# EasyEDA Pro project RK3566_handy_V1.0.epro, schematic RK3566_2, sheets 14 to 20 of 25

## Sheets
14 RK3566_OSC/PLL/PMUO1/2: Create Date: 2026-09-20; Page Name: RK3566_OSC/PLL/PMUO1/2; Update Date: 2026-09-20
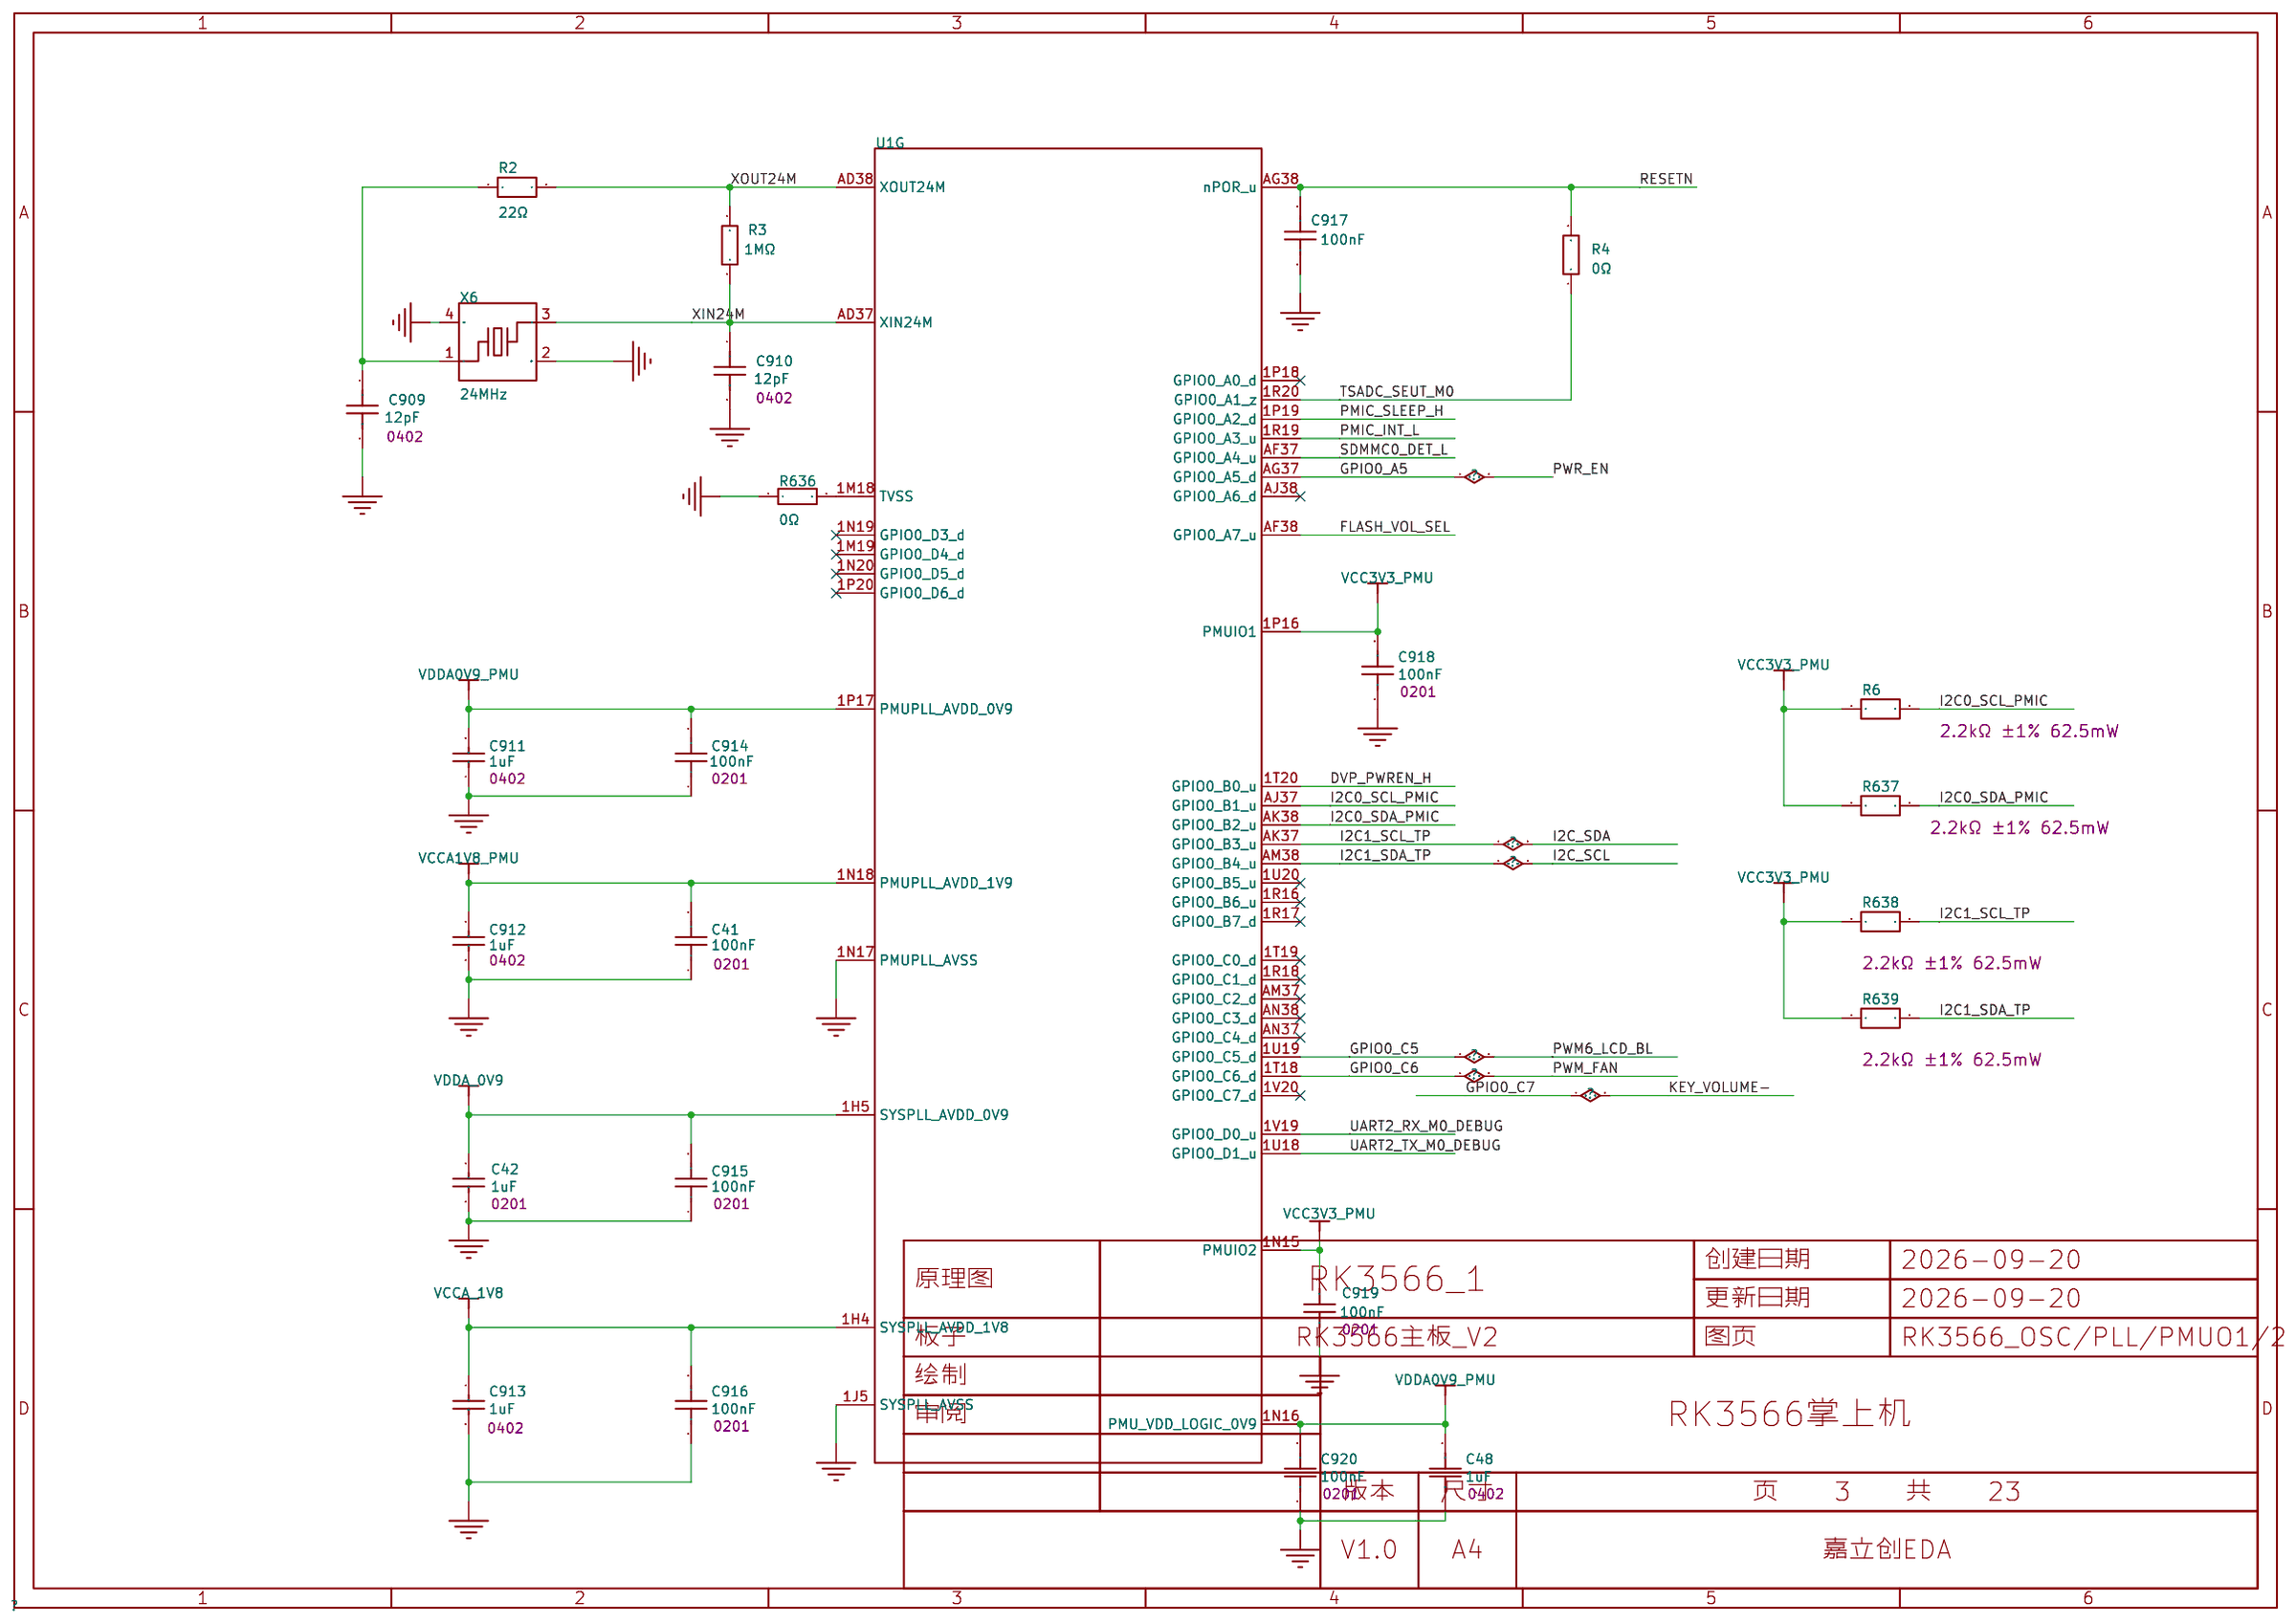
[diagram p13: RK3566_OSC/PLL/PMUO1/2]
15 RK3566_VO INTERFACE_2: Create Date: 2026-09-20; Page Name: RK3566_VO INTERFACE_2; Update Date: 2026-09-20
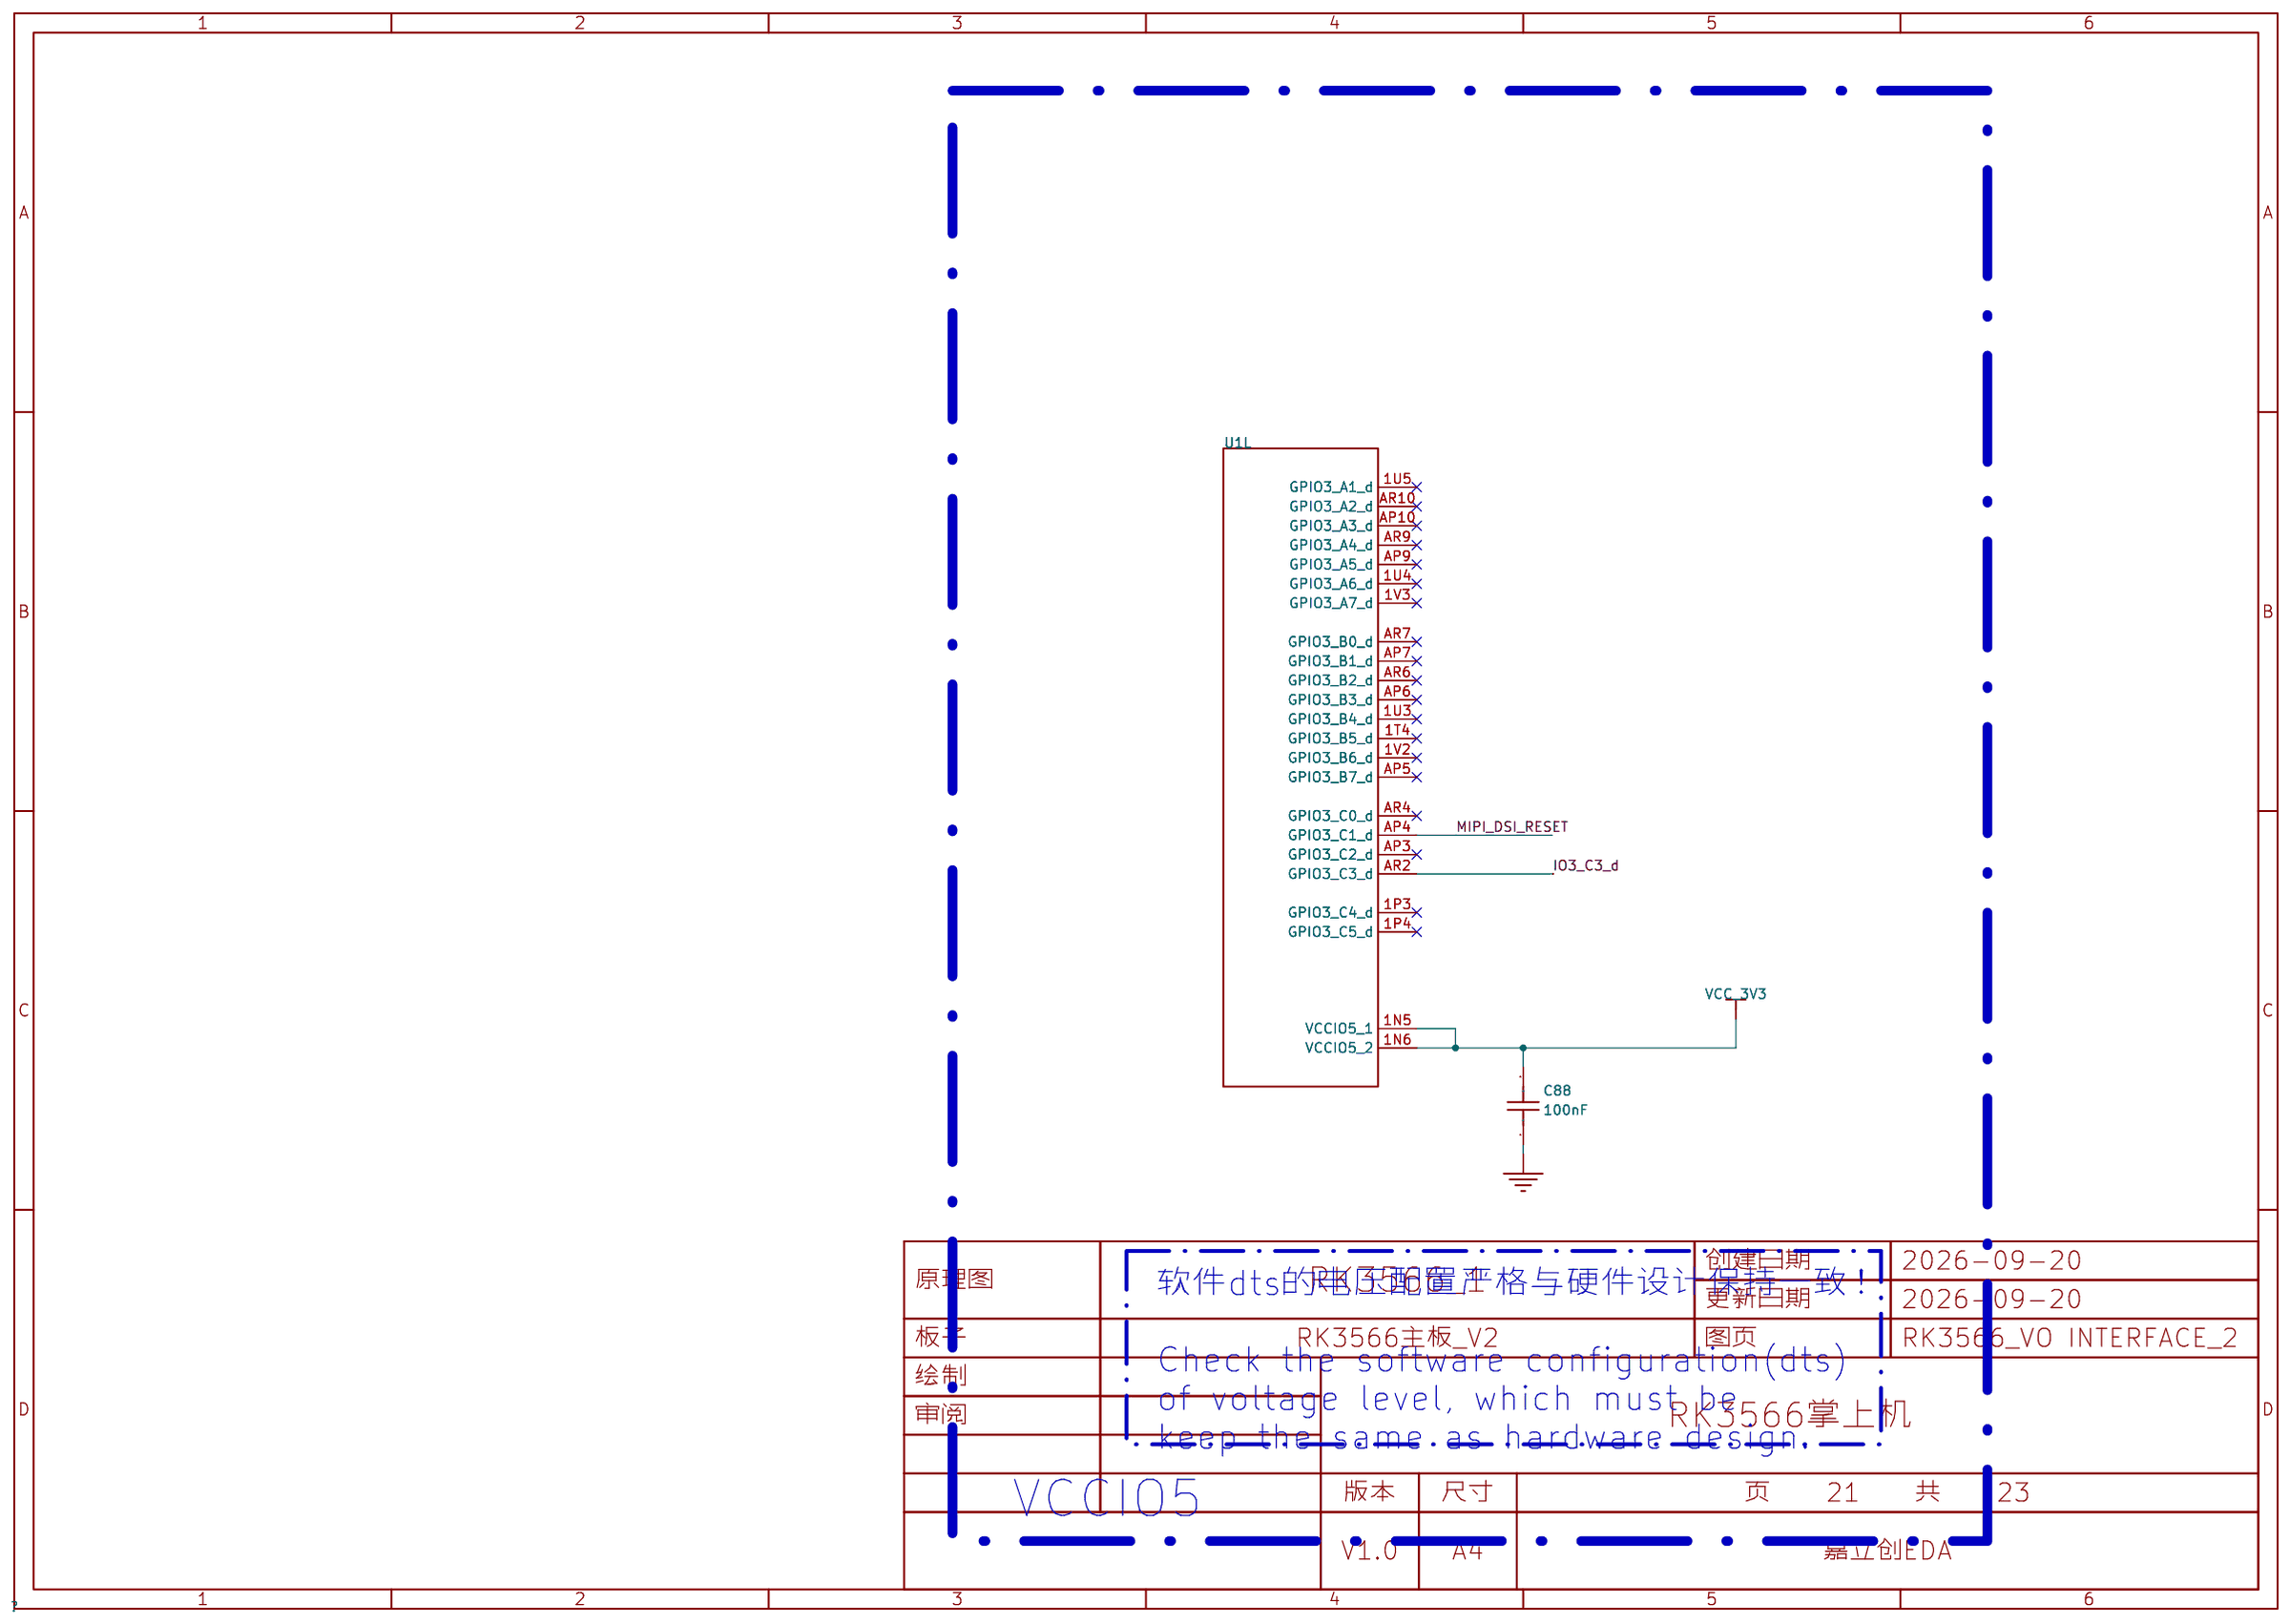
[diagram p14: RK3566_VO INTERFACE_2]
16 DEBUG: Create Date: 2026-09-22; Page Name: DEBUG; Update Date: 2026-09-22
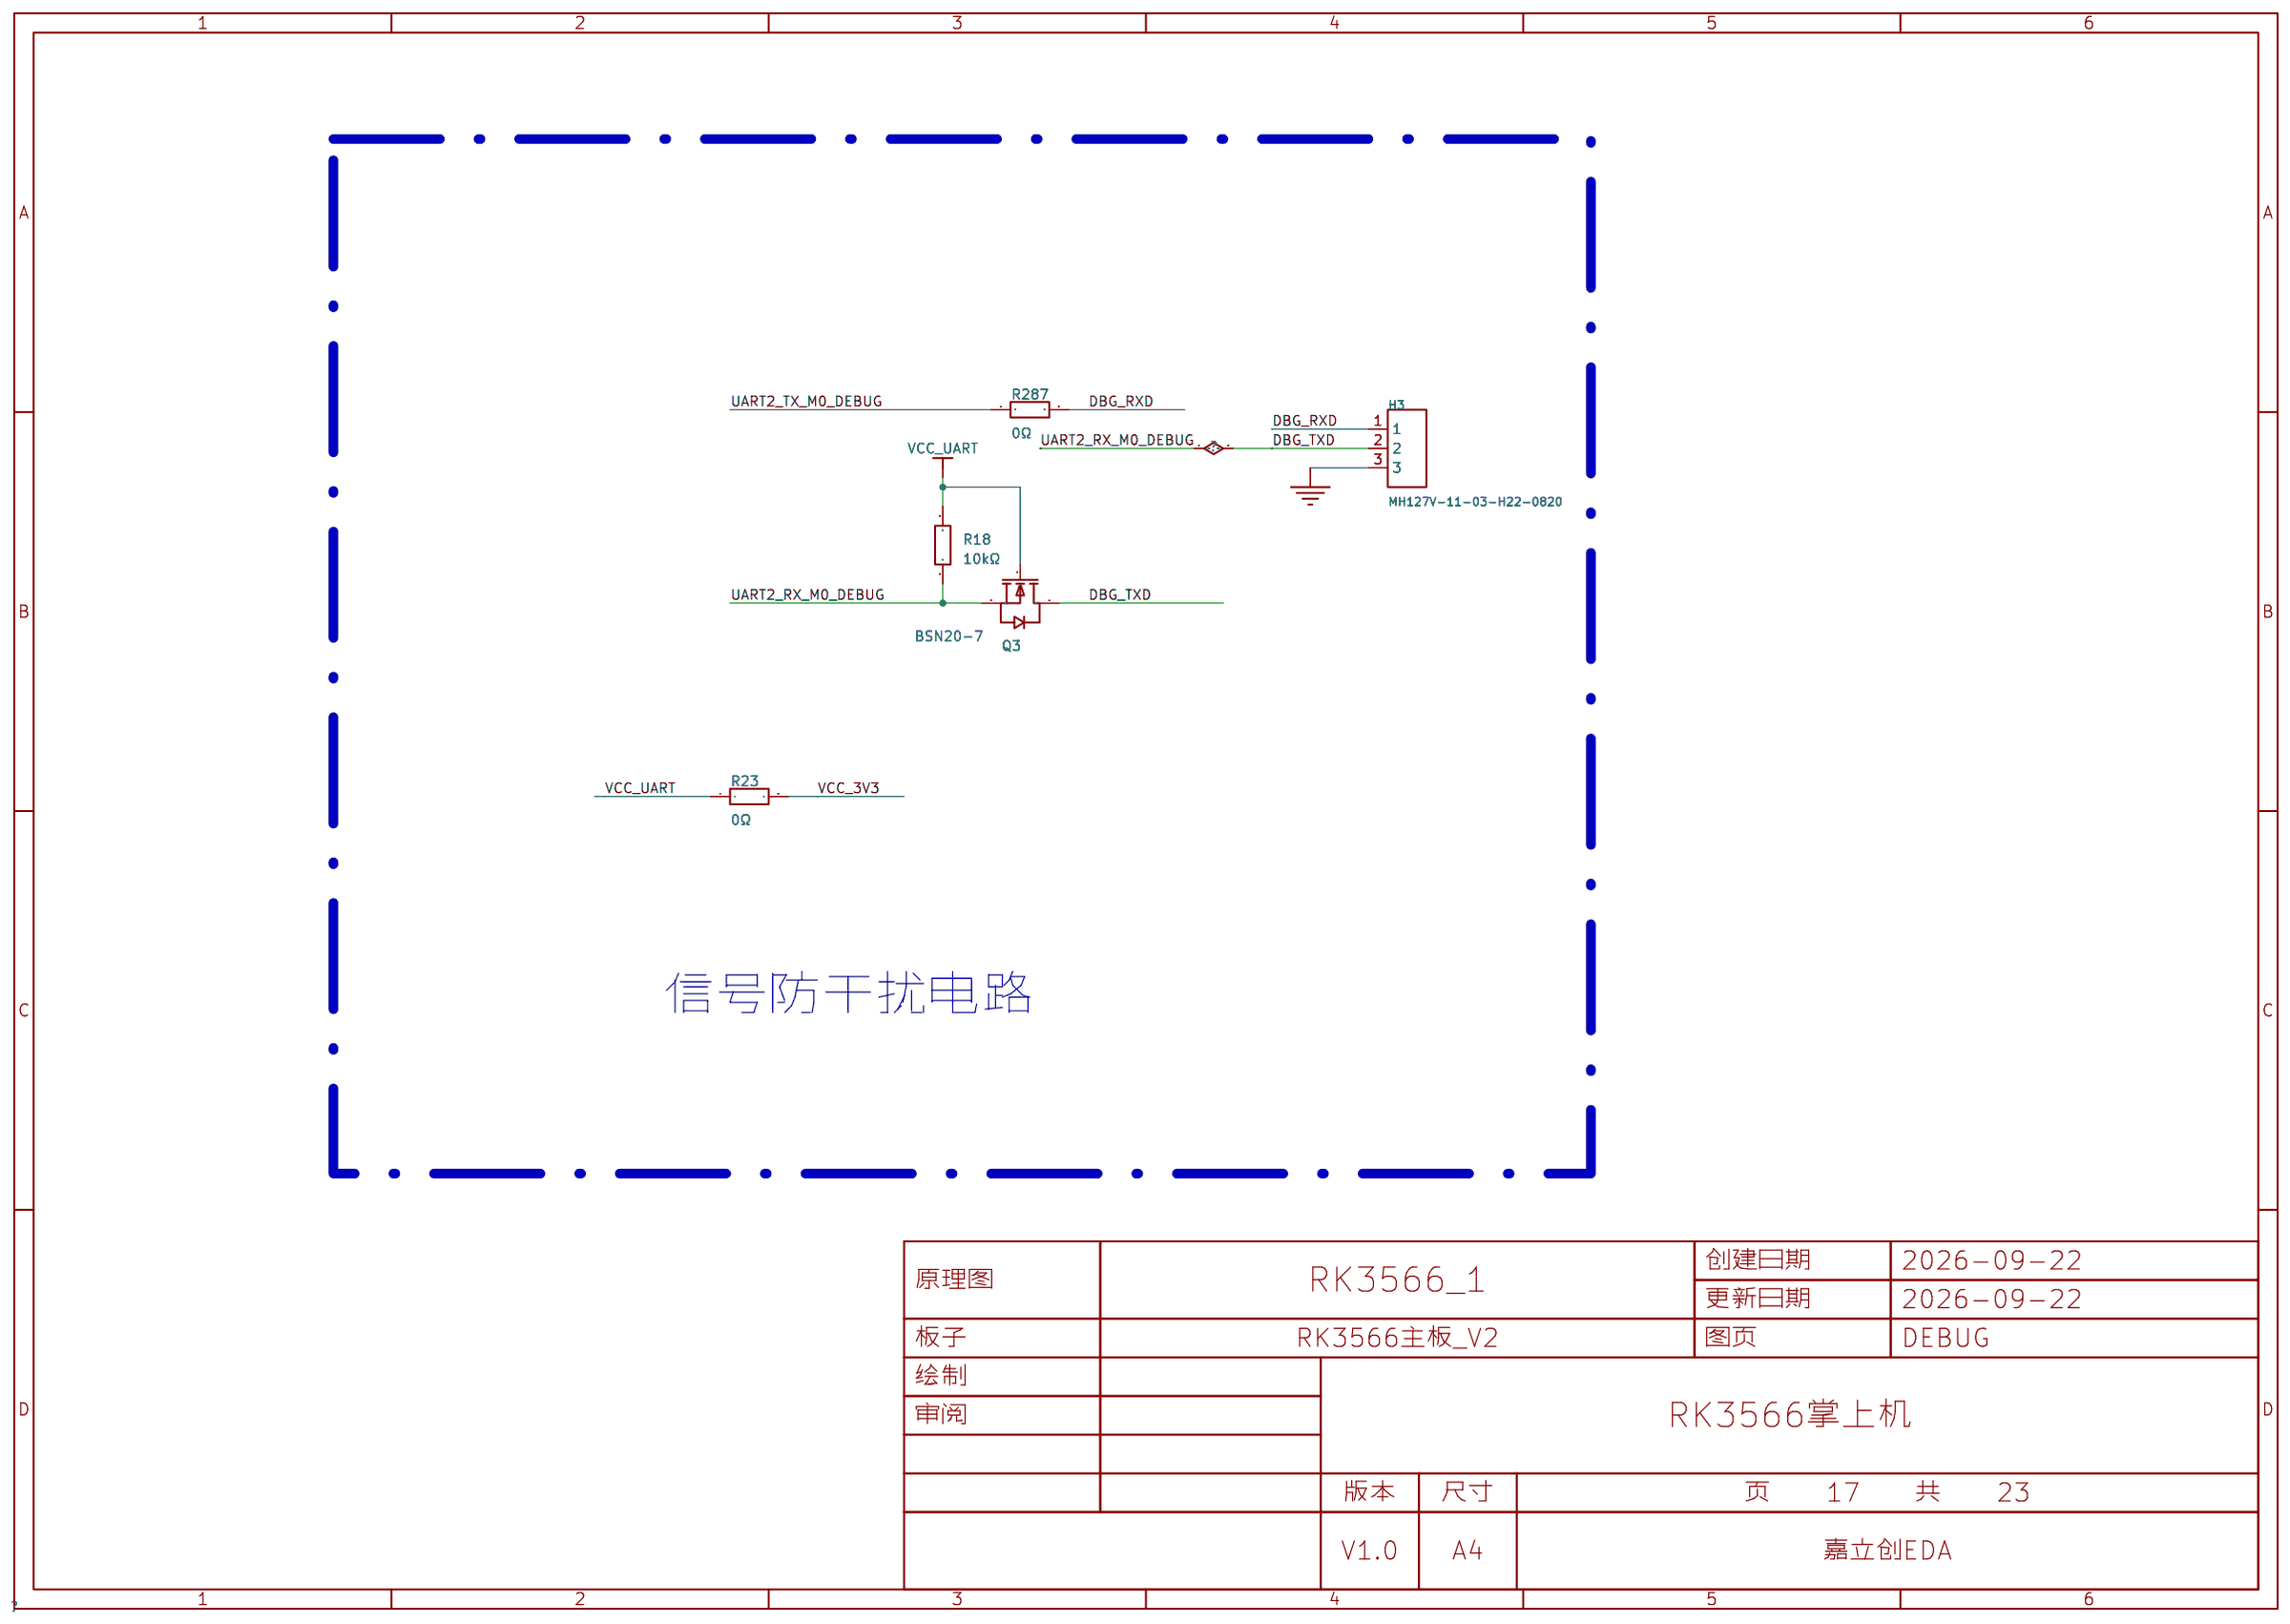
[diagram p15: DEBUG]
17 Sensor: Assembly Variant: Basic; Board Name: RK3566主板; Create Date: 2026-09-23; Page Name: P1; Project Name: RK3566手机; Update Date: 2026-09-23
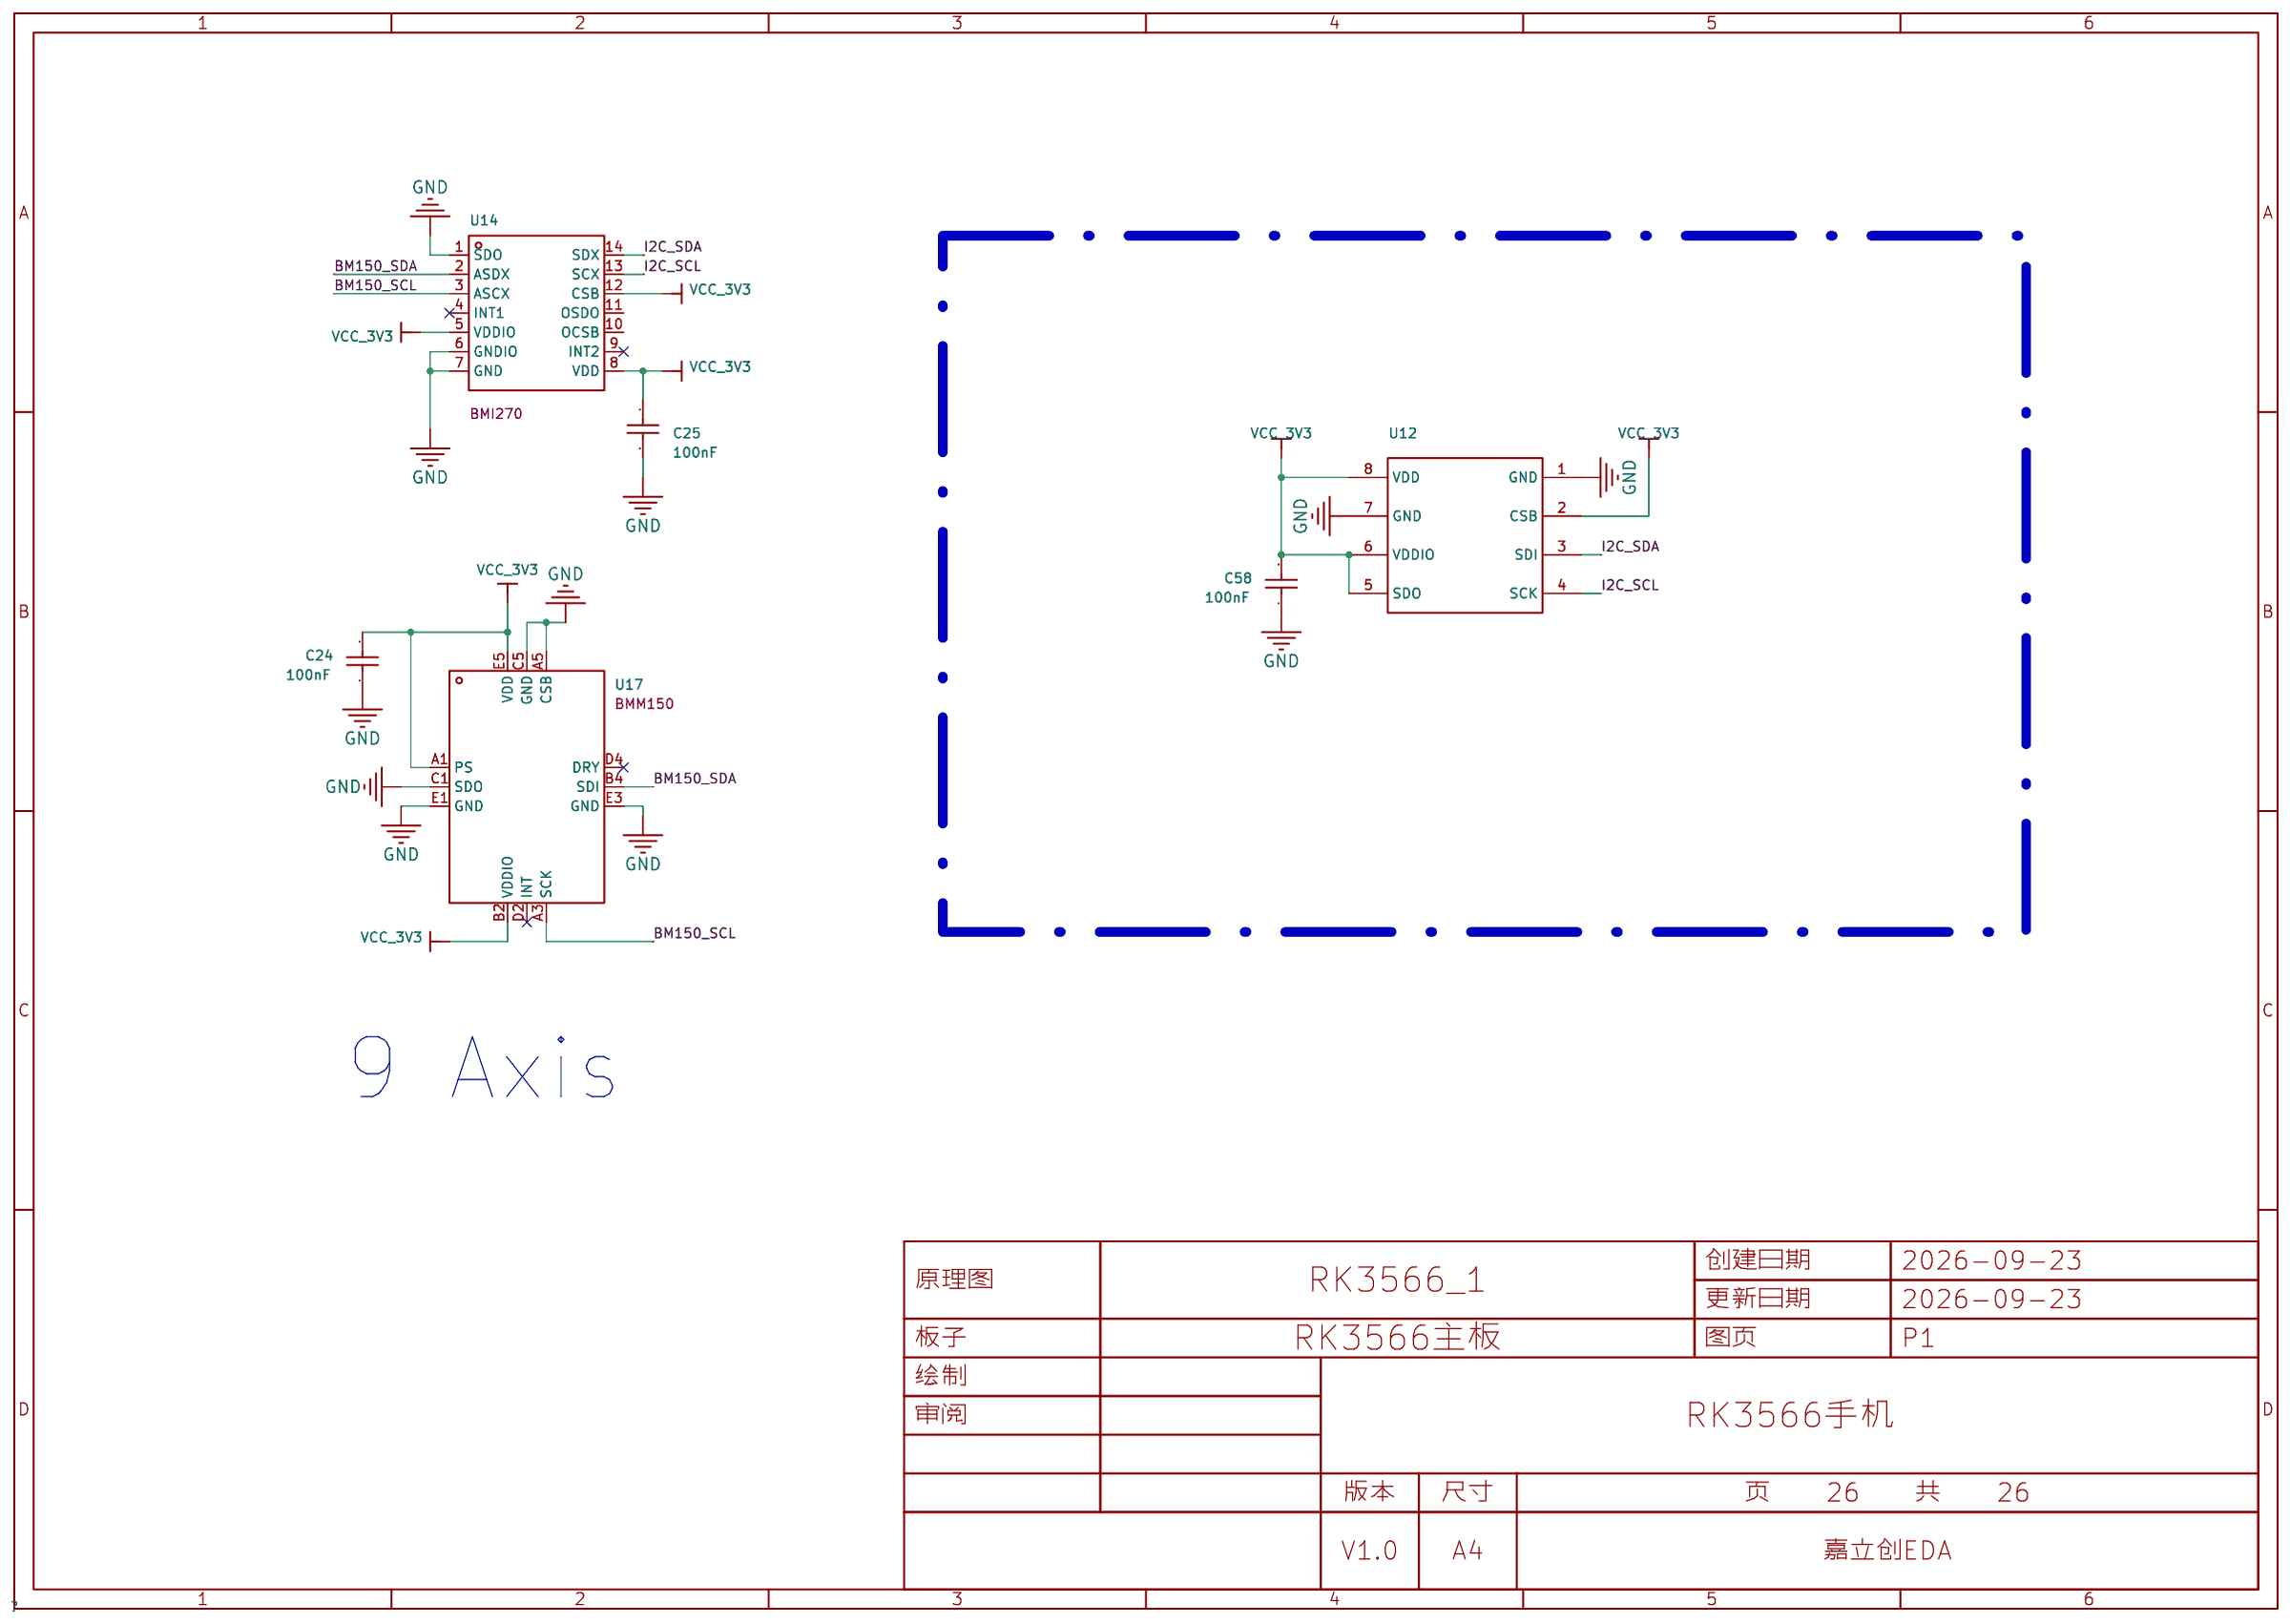
[diagram p16: Sensor]
18 MicroSD_Card: Create Date: 2026-09-28; Page Name: MicroSD_Card; Update Date: 2026-09-28
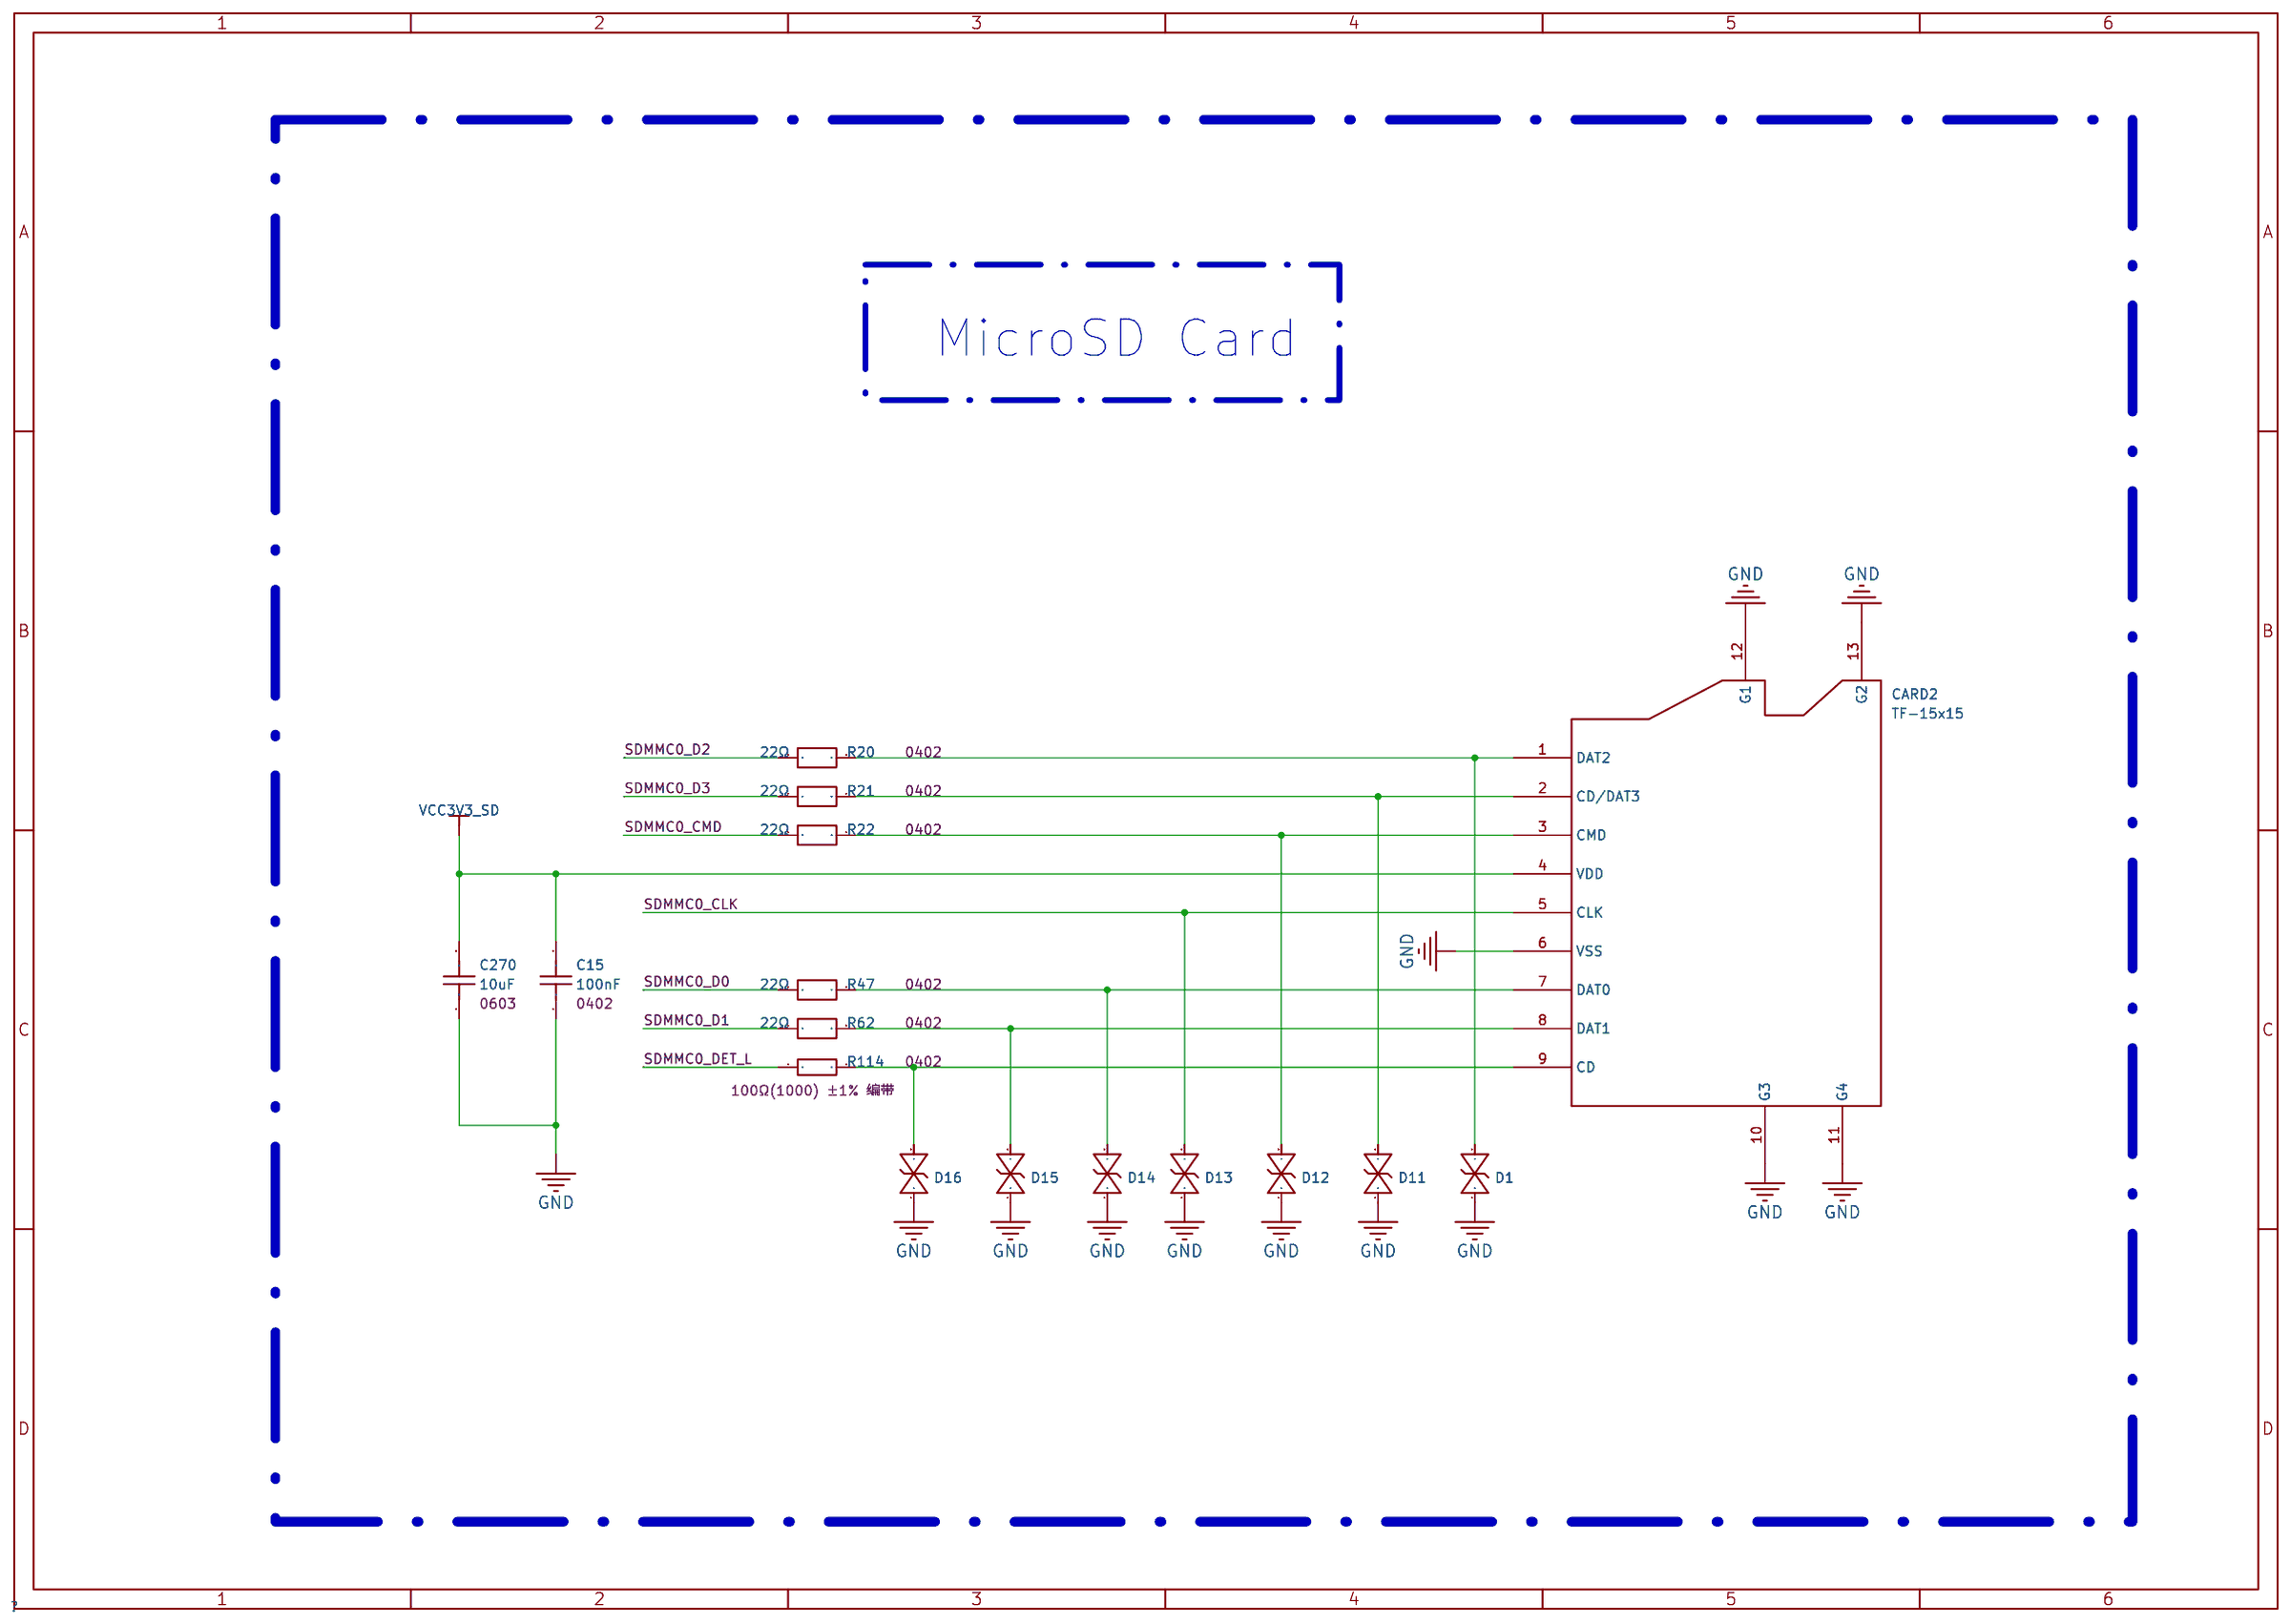
[diagram p17: MicroSD_Card]
19 KEY/FAN/RTC: Create Date: 2026-09-28; Page Name: KEY/FAN/RTC; Update Date: 2026-09-28
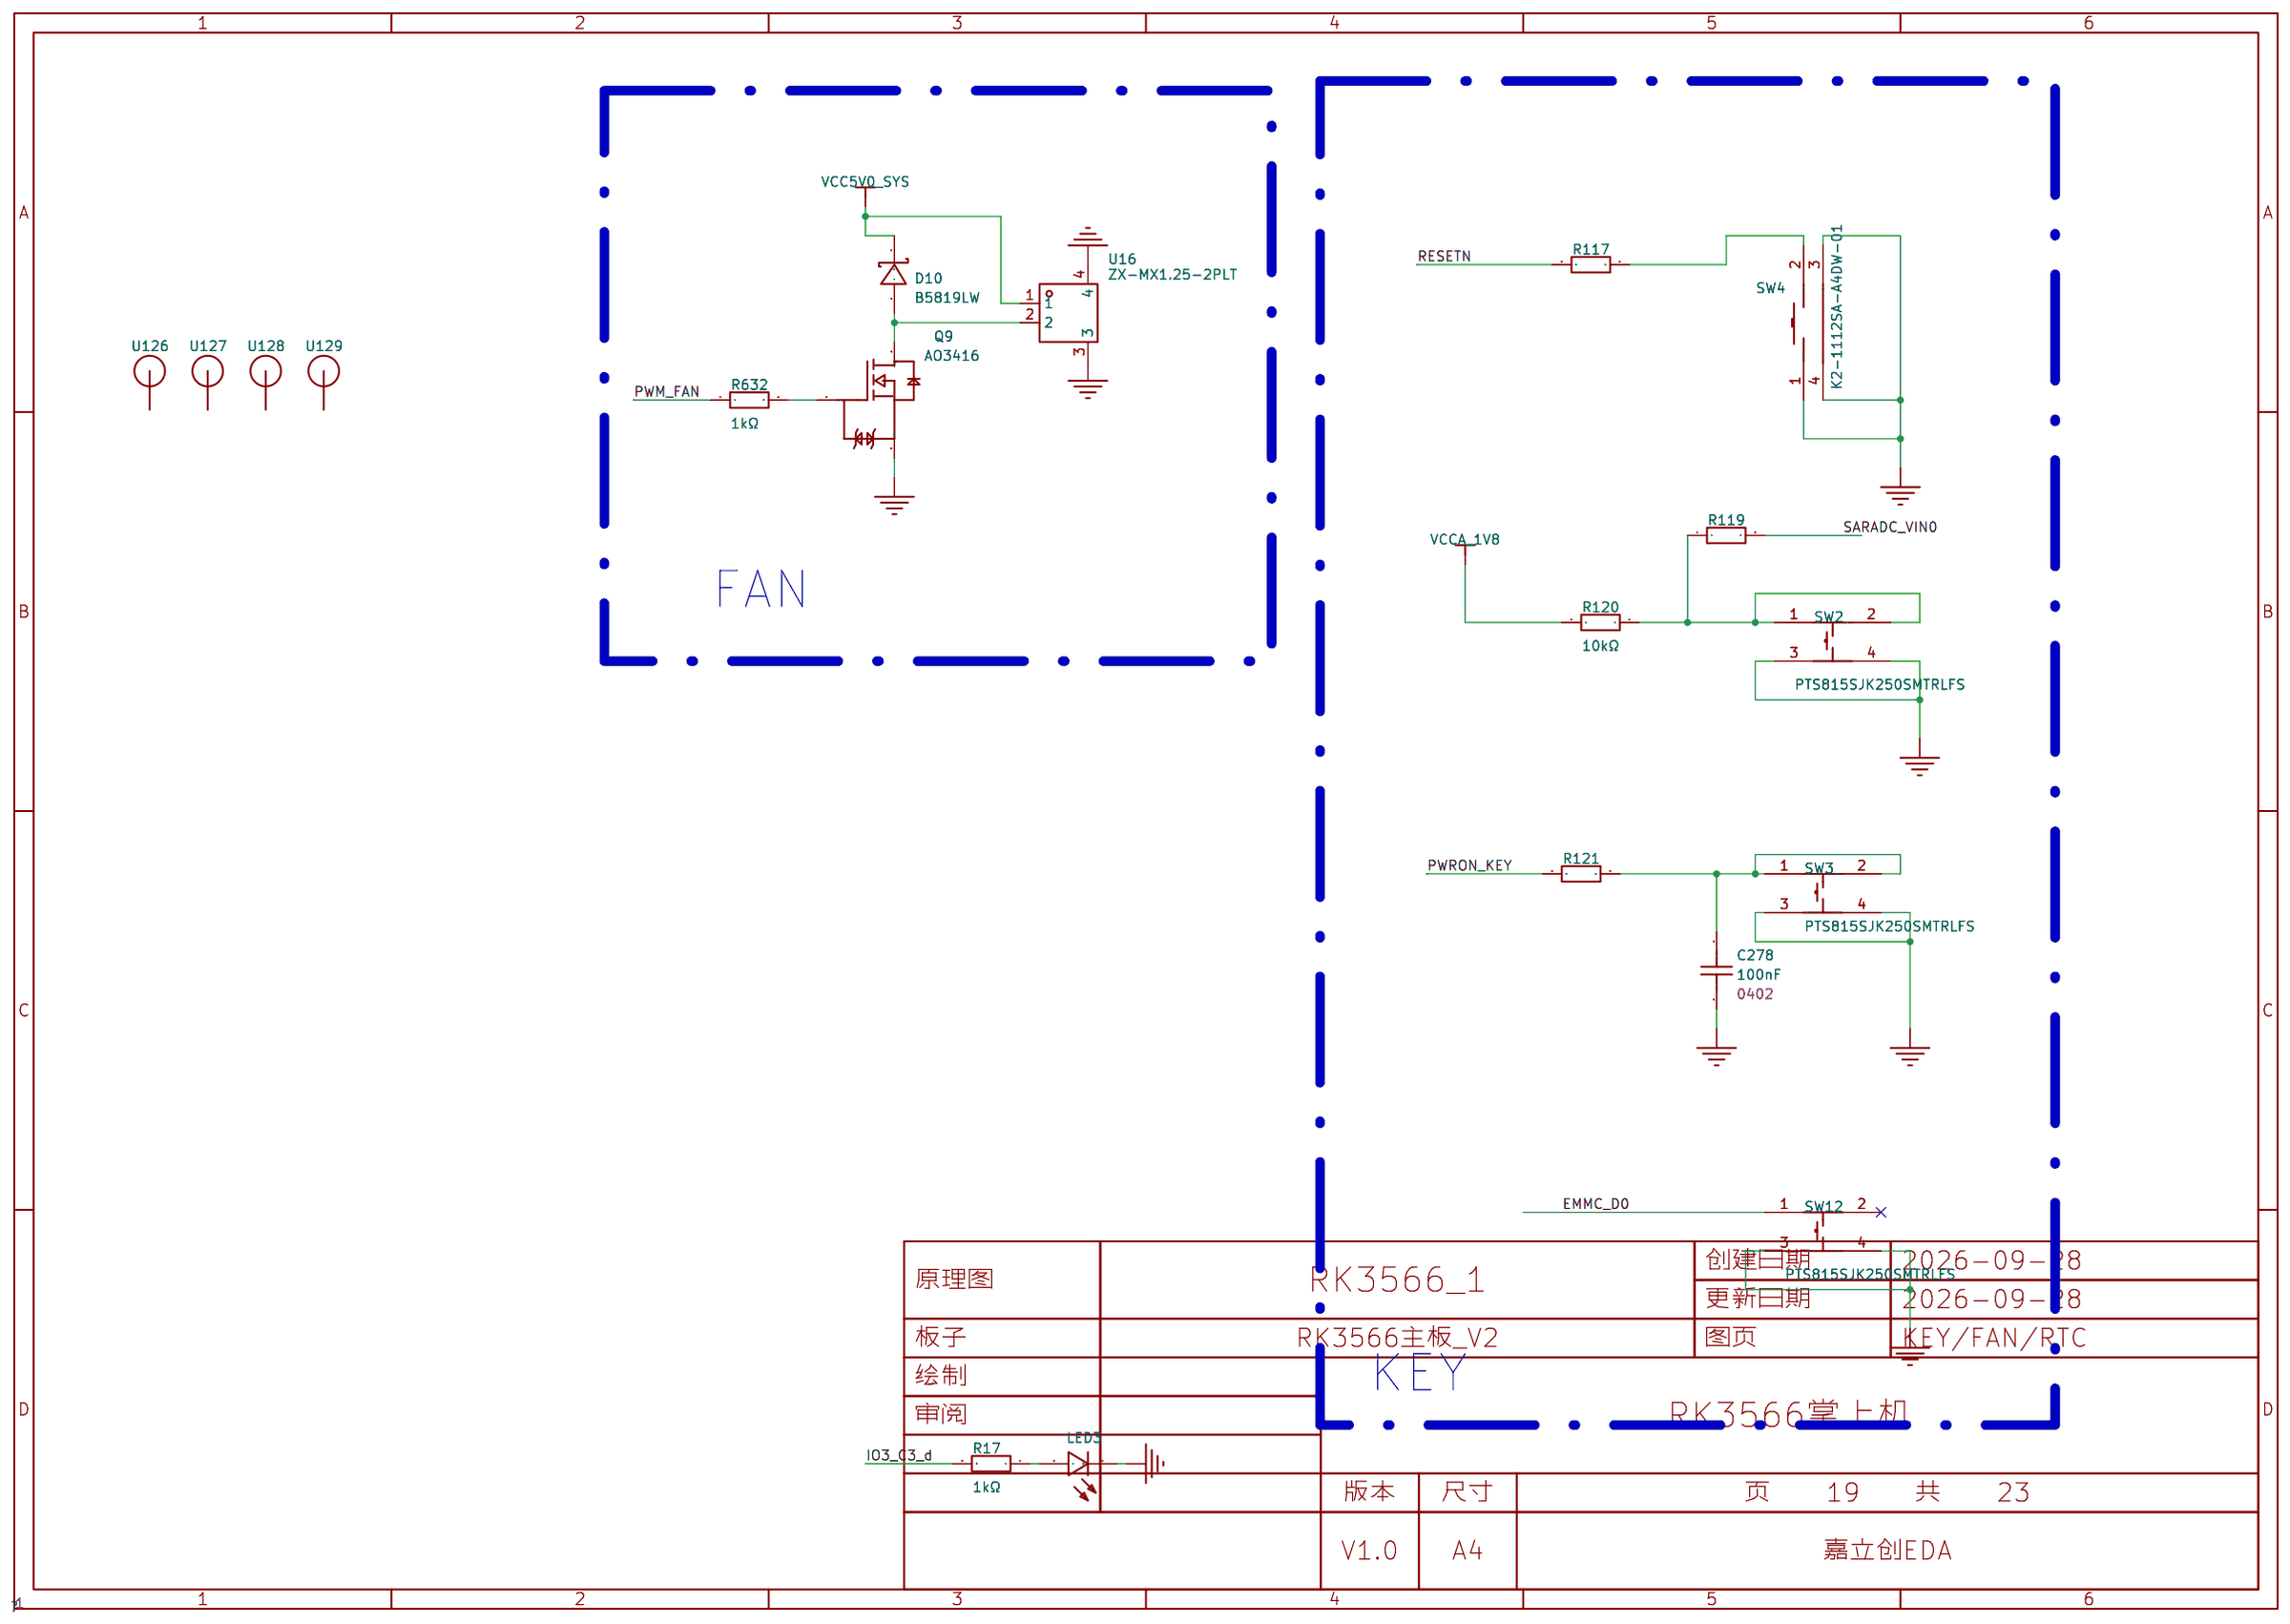
[diagram p18: KEY/FAN/RTC]
20 AUDIO: Create Date: 2026-09-28; Page Name: AUDIO; Update Date: 2026-09-28
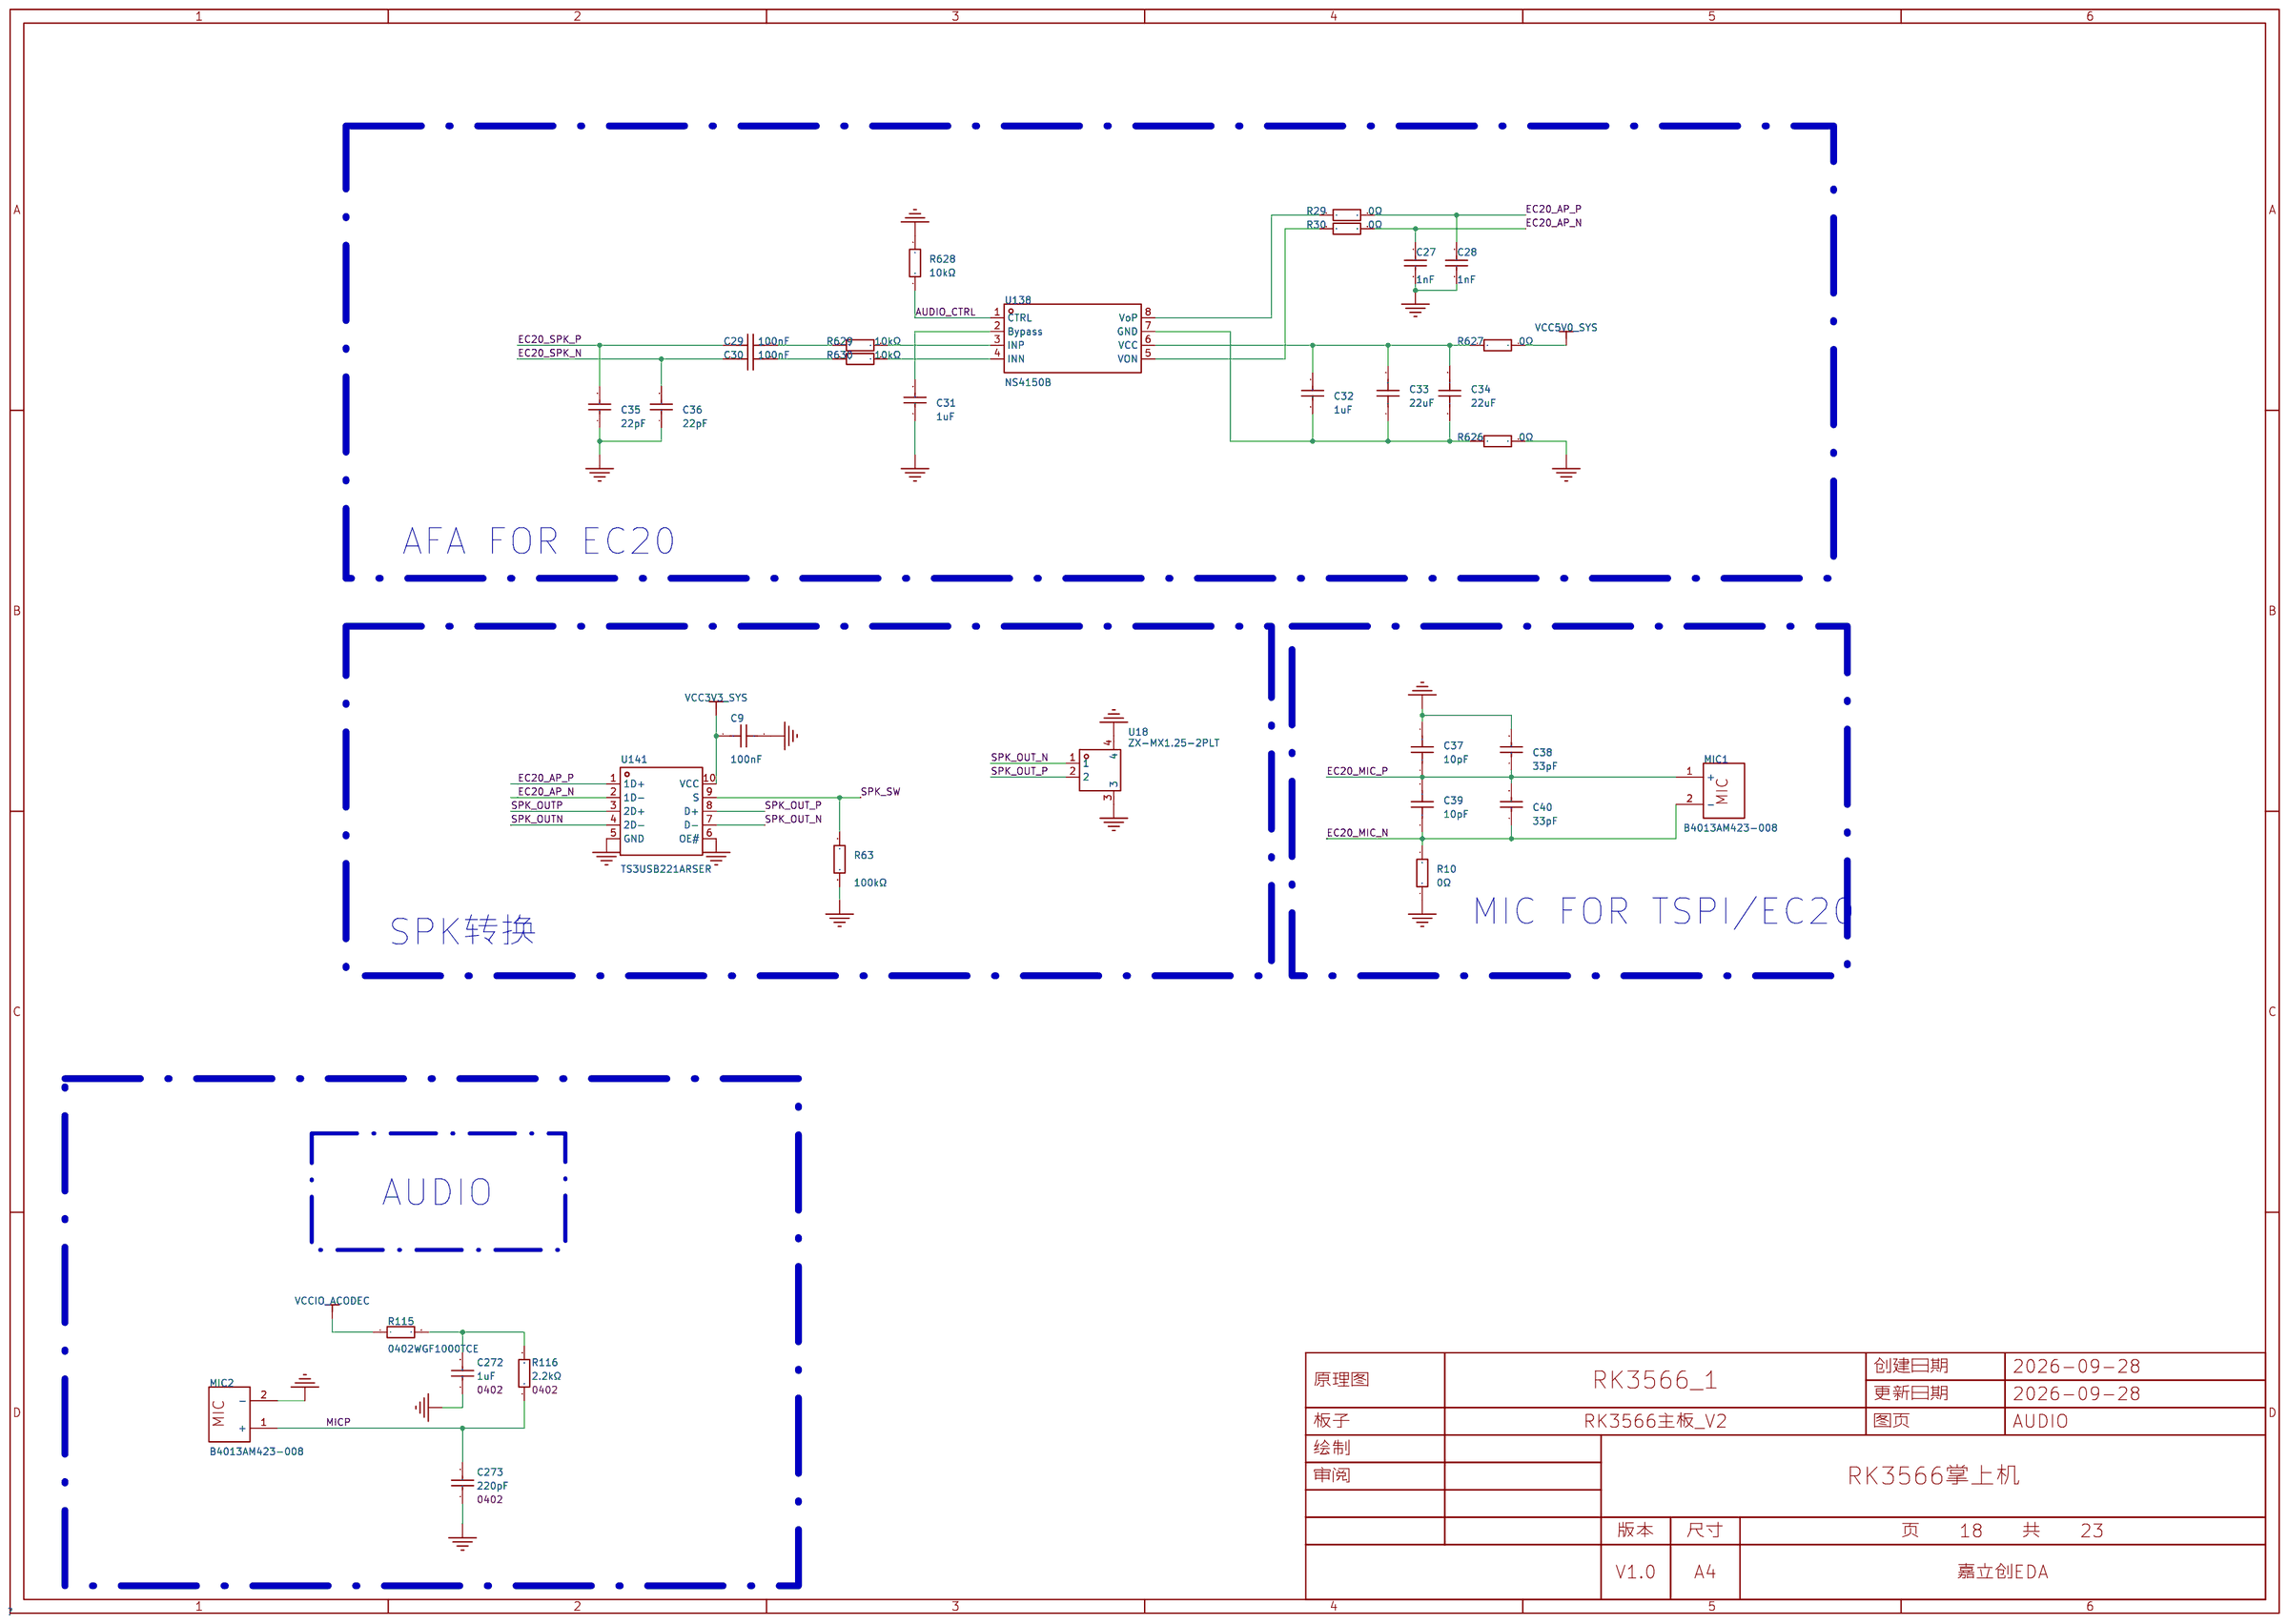
[diagram p19: AUDIO]

## Parts
sheet AUDIO
C9  100nF  [c0402]
C27  1nF  [c0402]
C28  1nF  [c0402]
C29  100nF  [c0402]
C30  100nF  [c0402]
C31  1uF  [c0402]
C32  1uF  [c_0603]
C33  22uF  [C0805]
C34  22uF  [c_0603]
C35  22pF  [c0402]
C36  22pF  [c0402]
C37  10pF  [c0402]
C38  33pF  [c0402]
C39  10pF  [c0402]
C40  33pF  [c0402]
C272  1uF  [LL_0402]
C273  220pF  [LL_0402]
MIC1  B4013AM423-008  [MIC-SMD_BD4.0_B4013AM423-008]
MIC2  B4013AM423-008  [MIC-SMD_BD4.0_B4013AM423-008]
R10  0Ω  [r0402]
R29  0Ω  [r0402]
R30  0Ω  [r0402]
R63  100kΩ  [r0402]
R115  0402WGF1000TCE  [LL_0402]
R116  2.2kΩ  [LL_0402]
R626  0Ω  [r0402]
R627  0Ω  [r0402]
R628  10kΩ  [r0402]
R629  10kΩ  [r0402]
R630  10kΩ  [r0402]
U18  ZX-MX1.25-2PLT  [CONN-SMD_2P-P1.25-MX1.25-2P-LT]
U138  NS4150B  [MSOP-8_L3.0-W3.0-P0.65-LS5.0-BL]
U141  TS3USB221ARSER  [UQFN-10_L2.0-W1.5-P0.50-BL]
sheet DEBUG
H3  MH127V-11-03-H22-0820  [HDR-TH_3P-P1.27-V_PZ127V-11-03-H25]
Q3  BSN20-7  [SOT-23-3_L2.9-W1.3-P1.90-LS2.4-BR]
R18  10kΩ  [LL_0402]
R23  0Ω  [RR_0402]
R287  0Ω  [LL_0402]
sheet KEY/FAN/RTC
C278  100nF  [LL_0402]
D10  B5819LW  [SOD-123_L2.8-W1.8-LS3.7-RD]
LED3  19-217/GHC-YR1S2/3T  [LED0603-RD]
Q9  AO3416  [SOT-23-3_L2.9-W1.6-P1.90-LS2.8-BR]
R17  1kΩ  [R0402]
R117  0402WGF1000TCE  [LL_0402]
R119  0402WGF1000TCE  [LL_0402]
R120  10kΩ  [LL_0402]
R121  0402WGF1000TCE  [LL_0402]
R632  1kΩ  [LL_0402]
SW2  PTS815SJK250SMTRLFS  [SW-SMD_4P-L4.2-W3.3-P2.15-LS5.1]
SW3  PTS815SJK250SMTRLFS  [SW-SMD_4P-L4.2-W3.3-P2.15-LS5.1]
SW4  K2-1112SA-A4DW-01  [KEY-TH_K2-1112SA-AXXW-XX]
SW12  PTS815SJK250SMTRLFS  [SW-SMD_4P-L4.2-W3.3-P2.15-LS5.1]
U16  ZX-MX1.25-2PLT  [CONN-SMD_2P-P1.25-MX1.25-2P-LT]
U126  -  [M3外5内3]
U127  -  [M3外5内3]
U128  -  [M3外5内3]
U129  -  [M3外5内3]
sheet MicroSD_Card
C15  100nF  [R0402]
C270  10uF  [C0603]
CARD2  TF-15x15  [TF-SMD_TF-15-15]
D1  KLXES15AAA1  [R0402]  (no BOM)
D11  KLXES15AAA1  [R0402]  (no BOM)
D12  KLXES15AAA1  [R0402]  (no BOM)
D13  KLXES15AAA1  [R0402]  (no BOM)
D14  KLXES15AAA1  [R0402]  (no BOM)
D15  KLXES15AAA1  [R0402]  (no BOM)
D16  KLXES15AAA1  [R0402]  (no BOM)
R20  22Ω  [R0402]
R21  22Ω  [R0402]
R22  22Ω  [R0402]
R47  22Ω  [R0402]
R62  22Ω  [R0402]
R114  0402WGF1000TCE  [R0402]
sheet RK3566_OSC/PLL/PMUO1/2
C41  100nF  [CC_0201]
C42  1uF  [CC_0201]
C48  1uF  [CC0402]
C909  12pF  [LL_0402]
C910  12pF  [LL_0402]
C911  1uF  [CC0402]
C912  1uF  [CC0402]
C913  1uF  [CC0402]
C914  100nF  [CC_0201]
C915  100nF  [CC_0201]
C916  100nF  [CC_0201]
C917  100nF  [CC_0201]
C918  100nF  [CC_0201]
C919  100nF  [CC_0201]
C920  100nF  [CC_0201]
R2  22Ω  [LL_0402]
R3  1MΩ  [LL_0402]
R4  0Ω  [LL_0402]
R6  2.2kΩ  [LL_0402]
R636  0Ω  [RR_0201]
R637  2.2kΩ  [LL_0402]
R638  2.2kΩ  [LL_0402]
R639  2.2kΩ  [LL_0402]
X6  24MHz  [CRYSTAL-SMD_4P-L2.0-W1.6-BL]
sheet RK3566_POWER
U1  -  [BGA-565_L15.5-W14.4-P0.40_RK3566_1]  (sections 1,10,11,12,13,14,15,16,17,18,19,2,20,21,22,3,4,5,6,7,8,9)
sheet RK3566_VO INTERFACE_2
C88  100nF  [CC_0201]
sheet Sensor
C24  100nF  [C0402]
C25  100nF  [C0402]
C58  100nF  [C0402]
U12  BMP280  [WLGA-8_L2.5-W2.0-P0.65-TR_DPS422]
U14  BMI270  [LGA-14_L3.0-W2.5-P0.50-BR]
U17  BMM150  [WLCSP-12_L1.6-W1.6_BMM150]

## Library data of the parts
C9 = FCC0402B104K160AT: 容值:100nF;精度:±10%;额定电压:16V;温度系数:X7R;; LCSC Part Name: 100nF ±10% 16V; Supplier Part: C5137468; Manufacturer: FOJAN(富捷); Supplier Footprint: 0402; JLCPCB Part Class: 扩展库; Datasheet: https://item.szlcsc.com/datasheet/FCC0402B104K160AT/5746970.html; Supplier: LCSC; Tolerance: ±10%; Voltage Rating: 16V; Temperature Coefficient: X7R
C27 C28 = CC0402KRX7R9BB102: 容值:1nF;精度:±10%;额定电压:50V;材质(温度系数):X7R;; LCSC Part Name: 1nF ±10% 50V; Supplier Part: C106205; Manufacturer: YAGEO(国巨); Supplier Footprint: 0402; JLCPCB Part Class: 扩展库; Datasheet: https://atta.szlcsc.com/upload/public/pdf/source/20171226/C106205_15142609593391205665.pdf; Supplier: LCSC; Tolerance: ±10%; Voltage Rated: 50V; Temperature Coefficient: X7R
C29 C30 = CL05B104KO5NNNC: 容值:100nF;精度:±10%;额定电压:16V;材质(温度系数):X7R;; LCSC Part Name: 100nF ±10% 16V; Supplier Part: C1525; Manufacturer: SAMSUNG(三星); Supplier Footprint: 0402; JLCPCB Part Class: Basic Part; Datasheet: https://atta.szlcsc.com/upload/public/pdf/source/20160218/1457707763339.pdf; Supplier: LCSC; Tolerance: ±10%; Voltage Rated: 16V; Temperature Coefficient: X7R
C31 = CL05A105KA5NQNC: 容值:1uF;精度:±10%;额定电压:25V;温度系数:X5R;; LCSC Part Name: 1uF ±10% 25V; Supplier Part: C52923; Manufacturer: SAMSUNG(三星); Supplier Footprint: 0402; JLCPCB Part Class: Basic Part; Datasheet: https://item.szlcsc.com/datasheet/CL05A105KA5NQNC/53938.html; Supplier: LCSC; Tolerance: ±10%; Voltage Rating: 25V; Temperature Coefficient: X5R; Voltage Rated: 25V
C32 = CL10A105KB8NNNC: 容值:1uF;精度:±10%;额定电压:50V;温度系数:X5R;; LCSC Part Name: 1uF ±10% 50V; Supplier Part: C15849; Manufacturer: SAMSUNG(三星); Supplier Footprint: 0603; JLCPCB Part Class: Basic Part; Datasheet: https://item.szlcsc.com/datasheet/CL10A105KB8NNNC/16531.html; Supplier: LCSC; Tolerance: ±10%; Voltage Rating: 50V; Temperature Coefficient: X5R; Voltage Rated: 50V
C33 C34 = CL21A226MAQNNNE: 容值:22uF;精度:±20%;额定电压:25V;材质(温度系数):X5R;; LCSC Part Name: 22uF ±20% 25V; Supplier Part: C45783; Manufacturer: SAMSUNG(三星); Supplier Footprint: 0805; JLCPCB Part Class: Basic Part; Datasheet: https://atta.szlcsc.com/upload/public/pdf/source/20160218/1457707763339.pdf; Supplier: LCSC; Tolerance: ±20%; Voltage Rated: 25V; Temperature Coefficient: X5R
C35 C36 = 0402CG220J500NT: 容值:22pF;精度:±5%;额定电压:50V;材质(温度系数):C0G;; LCSC Part Name: 22pF ±5% 50V; Supplier Part: C1555; Manufacturer: FH(风华); Supplier Footprint: 0402; JLCPCB Part Class: Basic Part; Datasheet: https://atta.szlcsc.com/upload/public/pdf/source/20200305/C486355_26A10D38EF8C2A5C37091D0039909270.pdf; Supplier: LCSC; Tolerance: ±5%; Voltage Rated: 50V; Temperature Coefficient: C0G
C37 C39 = CL05C100JB5NNNC: 容值:10pF;精度:±5%;额定电压:50V;材质(温度系数):C0G;; LCSC Part Name: 10pF ±5% 50V; Supplier Part: C32949; Manufacturer: SAMSUNG(三星); Supplier Footprint: 0402; JLCPCB Part Class: 基础库; Datasheet: https://atta.szlcsc.com/upload/public/pdf/source/20160218/1457707763339.pdf; Supplier: LCSC; Tolerance: ±5%; Voltage Rated: 50V; Temperature Coefficient: C0G
C38 C40 = 0402CG330J500NT: 容值:33pF;精度:±5%;额定电压:50V;材质(温度系数):C0G;; LCSC Part Name: 33pF ±5% 50V; Supplier Part: C1562; Manufacturer: FH(风华); Supplier Footprint: 0402; JLCPCB Part Class: 基础库; Datasheet: https://atta.szlcsc.com/upload/public/pdf/source/20200305/C486355_26A10D38EF8C2A5C37091D0039909270.pdf; Supplier: LCSC; Tolerance: ±5%; Voltage Rated: 50V; Temperature Coefficient: C0G
C272 C911-C913 = CL05A105KP5NNNC: 容值:1uF;精度:±10%;额定电压:10V;材质(温度系数):X5R;; LCSC Part Name: 1uF ±10% 10V; Supplier Part: C14445; Manufacturer: SAMSUNG(三星); Supplier Footprint: 0402; JLCPCB Part Class: 扩展库; Datasheet: https://atta.szlcsc.com/upload/public/pdf/source/20160103/1457707670698.pdf; Supplier: LCSC; Tolerance: ±10%; Voltage Rated: 10V; Temperature Coefficient: X5R
C273 = 0402B221K500NT: 容值:220pF;精度:±10%;额定电压:50V;材质(温度系数):X7R;; LCSC Part Name: 220pF ±10% 50V; Supplier Part: C1530; Manufacturer: FH(风华); Supplier Footprint: 0402; JLCPCB Part Class: 基础库; Datasheet: https://atta.szlcsc.com/upload/public/pdf/source/20170923/C1530_1506149257934988337.pdf; Supplier: LCSC; Tolerance: ±10%; Voltage Rated: 50V; Temperature Coefficient: X7R
MIC1 MIC2 = B4013AM423-008: LCSC Part Name: 驻极体电容φ4.0*1.3mm 1.0V-10V 灵敏度-42dB; Supplier Part: C233794; Manufacturer: Goertek(歌尔); JLCPCB Part Class: 扩展库; Datasheet: https://atta.szlcsc.com/upload/public/pdf/source/20180813/C233794_264218F4B1A78DA959E94BA30E23E4FF.pdf; Supplier: LCSC
R10 = RC0402JR-070RL: 电阻类型:厚膜电阻;阻值:0Ω;精度:±5%;功率:62.5mW;工作电压:50V;温度系数:-;; LCSC Part Name: 厚膜电阻 0Ω ±5% 62.5mW; Supplier Part: C60485; Manufacturer: YAGEO(国巨); Supplier Footprint: 0402; JLCPCB Part Class: 扩展库; Datasheet: https://atta.szlcsc.com/upload/public/pdf/source/20170428/1493376821999.pdf; Supplier: LCSC; Type: 厚膜电阻; Tolerance: ±5%; Power(Watts): 62.5mW; Voltage-Supply(Max): 50V; Operating Temperature: -55℃~+155℃
R23 R29 R30 R287 R626 R627 = 0402WGF0000TCE: 电阻类型:厚膜电阻;阻值:0Ω;精度:±1%;功率:62.5mW;; LCSC Part Name: 0Ω ±1% 62.5mW; Supplier Part: C17168; Manufacturer: UNI-ROYAL(厚声); Supplier Footprint: 0402; JLCPCB Part Class: 基础库; Datasheet: https://atta.szlcsc.com/upload/public/pdf/source/20200306/C422600_1E6D84923E4A46A82E41ADD87F860B5C.pdf; Supplier: LCSC; Type: 厚膜电阻; Tolerance: ±1%; Power(Watts): 62.5mW; Temperature Coefficient: ±800ppm/℃; Overload Voltage (Max): 50V; Operating Temperature Range: -55℃~+155℃
R63 = 0402WGF1003TCE: 电阻类型:厚膜电阻;阻值:100kΩ;精度:±1%;功率:62.5mW;最大工作电压:50V;温度系数:±100ppm/℃;; LCSC Part Name: 100kΩ ±1% 62.5mW 厚膜电阻; Supplier Part: C25741; Manufacturer: UNI-ROYAL(厚声); Supplier Footprint: 0402; JLCPCB Part Class: 基础库; Datasheet: https://item.szlcsc.com/datasheet/0402WGF1003TCE/26484.html; Supplier: LCSC; Type: 厚膜电阻; Tolerance: ±1%; Power(Watts): 62.5mW; Voltage-Supply(Max): 50V; Temperature Coefficient: ±100ppm/℃; Operating Temperature: -55℃~+155℃; Overload Voltage (Max): 50V; Operating Temperature Range: -55℃~+155℃
R114 R115 R119 R121 = 0402WGF1000TCE: Supplier: LCSC; Supplier Part: C25076; Supplier Footprint: 0402; JLCPCB Part Class: Basic Part; LCSC Part Name: 100Ω(1000) ±1% 编带; Datasheet: https://atta.szlcsc.com/upload/public/pdf/source/20170920/C25076_1505901197574982707.pdf; Manufacturer: UNI-ROYAL(厚声)
R116 = 0402WGF2201TCE: 电阻类型:厚膜电阻;阻值:2.2kΩ;精度:±1%;功率:62.5mW;; LCSC Part Name: 2.2kΩ ±1% 62.5mW; Supplier Part: C25879; Manufacturer: UNI-ROYAL(厚声); Supplier Footprint: 0402; JLCPCB Part Class: 基础库; Datasheet: https://atta.szlcsc.com/upload/public/pdf/source/20200306/C422600_1E6D84923E4A46A82E41ADD87F860B5C.pdf; Supplier: LCSC; Type: 厚膜电阻; Tolerance: ±1%; Power(Watts): 62.5mW; Temperature Coefficient: ±100ppm/℃; Overload Voltage (Max): 50V; Operating Temperature Range: -55℃~+155℃
R120 R628 = 0402WGF1002TCE: 电阻类型:厚膜电阻;阻值:10kΩ;精度:±1%;功率:62.5mW;; LCSC Part Name: 10kΩ ±1% 62.5mW; Supplier Part: C25744; Manufacturer: UNI-ROYAL(厚声); Supplier Footprint: 0402; JLCPCB Part Class: 基础库; Datasheet: https://atta.szlcsc.com/upload/public/pdf/source/20200306/C422600_1E6D84923E4A46A82E41ADD87F860B5C.pdf; Supplier: LCSC; Type: 厚膜电阻; Tolerance: ±1%; Power(Watts): 62.5mW; Temperature Coefficient: ±100ppm/℃; Overload Voltage (Max): 50V; Operating Temperature Range: -55℃~+155℃
R629 R630 = 0402WGF1002TCE: 电阻类型:厚膜电阻;阻值:10kΩ;精度:±1%;功率:62.5mW;最大工作电压:50V;温度系数:±100ppm/℃;; LCSC Part Name: 10kΩ ±1% 62.5mW 厚膜电阻; Supplier Part: C25744; Manufacturer: UNI-ROYAL(厚声); Supplier Footprint: 0402; JLCPCB Part Class: Basic Part; Datasheet: https://atta.szlcsc.com/upload/public/pdf/source/20200306/C422600_1E6D84923E4A46A82E41ADD87F860B5C.pdf; Supplier: LCSC; Type: 厚膜电阻; Tolerance: ±1%; Power(Watts): 62.5mW; Temperature Coefficient: ±100ppm/℃; Overload Voltage (Max): 50V; Operating Temperature Range: -55℃~+155℃
U16 U18 = ZX-MX1.25-2PLT: 插针结构:1x2P;间距:1.25mm;安装方式:立贴;参考系列:PicoBlade(MX 1.25);总PIN数:2P;排数:1;每排PIN数:2;行距:-;额定电流:1A;触头材质:黄铜;触头镀层:锡;工作温度:-25℃~+85℃;; LCSC Part Name: 1x2P 间距:1.25mm 立贴 系列:PicoBlade(MX 1.25); Supplier Part: C7430473; Manufacturer: Megastar(兆星); Supplier Footprint: SMD,P=1.25mm; JLCPCB Part Class: Extended Part; Datasheet: https://item.szlcsc.com/datasheet/ZX-MX1.25-2PLT/8430342.html; Supplier: LCSC; Pins Structure: 1x2P; Pitch: 1.25mm; Mounting Type: 立贴; Reference Series: PicoBlade(MX 1.25); Number of Pins: 2P; Number of Rows: 1; Number of PINs Per Row: 2; Current Rating: 1A; Contact Material: 黄铜; Contact Plating: 锡; Operating Temperature: -25℃~+85℃; Voltage Rating: 125V; Plastic Material: LCP; Supplementary Features: 辅助焊脚; Color: 米色; Z-Height of the Board: 4.7mm; X-Length of Bottom Edge on Board (Spacing Line): 7.5mm; Y-Width of Bottom Edge on Board: 4.3mm
U138 = NS4150B_C189961: 功放类型:D类功放;输出功率:3Wx1@4Ω;; Supplier Part: C189961; Manufacturer: Nsiway(纳芯威); Supplier Footprint: MSOP-8; JLCPCB Part Class: 扩展库; Datasheet: https://atta.szlcsc.com/upload/public/pdf/source/20220916/DAE631F3909B9CBB38BDE76E3E6D5896.pdf; Supplier: LCSC; Type of Power Amplifier: D类功放; Output Power: 3Wx1@4Ω; Supply Voltage: 3V~5.25V
U141 = TS3USB221ARSER: 开关电路:单刀双掷(SPDT);带宽:900MHz;; LCSC Part Name: TS3USB221A ESD保护、高速USB2.0 (480-Mbps) 1:2多路复用器和解复用器开关，带单使能; Supplier Part: C128396; Manufacturer: TI(德州仪器); Supplier Footprint: UQFN-10(1.5x2); JLCPCB Part Class: 扩展库; Datasheet: https://www.ti.com/cn/lit/gpn/ts3usb221a; Supplier: LCSC; Switch Circuit: 单刀双掷(SPDT); -3dB Bandwidth: 900MHz; Voltage - Supply: 2.5V~3.3V; RDS(on): 6Ω; Operating Temperature: -40℃~+85℃
H3 = MH127V-11-03-H22-0820: 插针结构:1x3P;间距:1.27mm;圆针/方针:圆针;安装方式:直插;排数:单排;总PIN位数:3P;额定电流:1A;额定电压:60V;配合针长度:3mm;塑高:2.2mm;端接针长度:3mm;触头材质:铜合金;工作温度:-40℃~+105℃;; LCSC Part Name: 1x3P 间距:1.27mm 圆针 直插; Supplier Part: C53026581; Manufacturer: XFCN(兴飞); Supplier Footprint: 插件,P=1.25mm; JLCPCB Part Class: Extended Part; Datasheet: https://item.szlcsc.com/datasheet/MH127V-11-03-H22-0820/55965964.html; Supplier: LCSC; Pin Structure: 1x3P; Pitch: 1.27mm; Circluar Pins/Square Pins: 圆针; Mounting Type: 直插; Number of Rows: 单排; Number of Pins: 3P; Current Rating: 1A; Voltage Rating (Max): 60V; Length of Mating Pin: 3mm; Insulation Height: 2.2mm; Length of End Connection Pin: 3mm; Contact Material: 铜合金; Operating Temperature: -40℃~+105℃
Q3 = BSN20-7: 类型:1个N沟道;漏源电压(Vdss):50V;连续漏极电流(Id):500mA;导通电阻(RDS(on)@Vgs,Id):1.8Ω@10V;功率(Pd):600mW;阈值电压(Vgs(th)@Id):1.5V@250uA;; LCSC Part Name: 1个N沟道 耐压:50V 电流:500mA; Supplier Part: C155343; Manufacturer: DIODES(美台); Supplier Footprint: SOT-23; JLCPCB Part Class: 扩展库; Datasheet: https://atta.szlcsc.com/upload/public/pdf/source/20180307/C155343_15204109327611407861.pdf; Supplier: LCSC; Type: 1个N沟道; Drain Source Voltage (Vdss): 50V; Continuous Drain Current (Id): 500mA; Drain Source On Resistance (RDS(on)@Vgs,Id): 1.8Ω@10V; Power Dissipation (Pd): 600mW; Gate Threshold Voltage (Vgs(th)@Id): 1.5V@250uA; Total Gate Charge (Qg@Vgs): 800pC@10V; Input Capacitance (Ciss@Vds): 40pF@10V; Reverse Transfer Capacitance (Crss@Vds): 10pF@10V; Operating Temperature: -55℃~+150℃
R18 = 0402WGF1002TCE: 电阻类型:厚膜电阻;阻值:10kΩ;精度:±1%;功率:62.5mW;; LCSC Part Name: 10kΩ ±1% 62.5mW; Supplier Part: C25744; Manufacturer: UNI-ROYAL(厚声); Supplier Footprint: 0402; JLCPCB Part Class: 基础库; Datasheet: https://atta.szlcsc.com/upload/public/pdf/source/20200306/C422600_1E6D84923E4A46A82E41ADD87F860B5C.pdf; Supplier: LCSC; Type: 厚膜电阻; Tolerance: ±1%; Power(Watts): 62.5mW; Temperature Coefficient: ±100ppm/℃; Overload Voltage (Max): 50V; Operating Temperature Range: -55℃~+155℃; Voltage-Supply(Max): 50V; Operating Temperature: -55℃~+155℃
C278 = CL05B104KB54PNC: 容值:100nF;精度:±10%;额定电压:50V;温度系数:X7R;; LCSC Part Name: 100nF ±10% 50V; Supplier Part: C307331; Manufacturer: SAMSUNG(三星); Supplier Footprint: 0402; JLCPCB Part Class: 基础库; Datasheet: https://item.szlcsc.com/datasheet/CL05B104KB54PNC/291005.html; Supplier: LCSC; Tolerance: ±10%; Voltage Rating: 50V; Temperature Coefficient: X7R; Voltage Rated: 50V
D10 = B5819LW: 正向压降(Vf):600mV@1A;直流反向耐压(Vr):40V;平均整流电流(Io):500mA;; LCSC Part Name: 电压:40V 电流:500mA; Supplier Part: C181206; Manufacturer: Hottech(合科泰); Supplier Footprint: SOD-123; JLCPCB Part Class: 扩展库; Datasheet: https://atta.szlcsc.com/upload/public/pdf/source/20180202/C181206_15175649784091336405.pdf; Supplier: LCSC; Forward Voltage (Vf@If): 600mV@1A; Reverse Voltage (Vr): 40V; Average Rectified Current (Io): 500mA
LED3 = 19-217/GHC-YR1S2/3T: 发光颜色:翠绿;二极管配置:-;主波长:520nm~535nm;色温:-;功率:110mW;安装方式:-;; Supplier Part: C72043; Manufacturer: EVERLIGHT(亿光); Supplier Footprint: 0603; JLCPCB Part Class: Basic Part; Datasheet: https://atta.szlcsc.com/upload/public/pdf/source/20160507/1462613613780.pdf; Supplier: LCSC; Emitted Color: 翠绿; Lens Color: 无色透明; Dominant Wavelength: 520nm~535nm; Peak Wavelength: 518nm; Forward Current: 20mA; Power Dissipation: 110mW; Viewing Angle: 120°; Operating Temperature: -40℃~+85℃
Q9 = AO3416_C5123927: Supplier Part: C5123927; Manufacturer: TECH PUBLIC(台舟); Supplier Footprint: SOT-23; JLCPCB Part Class: 扩展库; Datasheet: https://atta.szlcsc.com/upload/public/pdf/source/20221018/C7CFD0E42C199F209D1305BCA8427DCC.pdf; Supplier: LCSC
R17 = RC0402FR-07232KL: 电阻类型:厚膜电阻;阻值:232kΩ;精度:±1%;功率:62.5mW;; LCSC Part Name: 232kΩ ±1% 62.5mW; Supplier Part: C309542; Manufacturer: YAGEO(国巨); Supplier Footprint: 0402; JLCPCB Part Class: Extended Part; Datasheet: https://atta.szlcsc.com/upload/public/pdf/source/20181009/C309542_CA3F4488430805647C87B9489F02B718.pdf; Supplier: LCSC; Type: 厚膜电阻; Tolerance: ±1%; Power(Watts): 62.5mW; Temperature Coefficient: ±100ppm/℃; Overload Voltage (Max): 50V; Operating Temperature Range: -55℃~+155℃
R117 = 0402WGF1000TCE: Supplier: LCSC; Supplier Part: C25076; Supplier Footprint: 0402; JLCPCB Part Class: Basic Part; LCSC Part Name: 100Ω(1000) ±1%; Datasheet: https://atta.szlcsc.com/upload/public/pdf/source/20170920/C25076_1505901197574982707.pdf; Manufacturer: UNI-ROYAL(厚声)
R632 = 0402WGF1001TCE: 电阻类型:厚膜电阻;阻值:1kΩ;精度:±1%;功率:62.5mW;温度系数:±100ppm/℃;最大工作电压:50V;工作温度范围:-55℃~+155℃;; LCSC Part Name: 1kΩ ±1% 62.5mW; Supplier Part: C11702; Manufacturer: UNI-ROYAL(厚声); Supplier Footprint: 0402; JLCPCB Part Class: Basic Part; Datasheet: https://atta.szlcsc.com/upload/public/pdf/source/20200306/C422600_1E6D84923E4A46A82E41ADD87F860B5C.pdf; Supplier: LCSC; Type: 厚膜电阻; Tolerance: ±1%; Power(Watts): 62.5mW; Temperature Coefficient: ±100ppm/℃; Overload Voltage (Max): 50V; Operating Temperature Range: -55℃~+155℃
SW2 SW3 SW12 = PTS815SJK250SMTRLFS: 操作寿命10万次，使用温度-20°C 至 70°C,尺寸4.20mmx3.20mmx2.50mm，操作力度2.5N; LCSC Part Name: 轻触开关; Supplier Part: C918859; Manufacturer: CK; Supplier Footprint: SMD; JLCPCB Part Class: Extended Part; Datasheet: https://atta.szlcsc.com/upload/public/pdf/source/20190916/C411883_4F77F16E1D8E48DC707D8949CEE7CF80.pdf; Supplier: LCSC
SW4 = K2-1112SA-A4DW-01: 作用力:2.5N;安装方式:卧贴;开关长度:7mm;开关宽度:3.5mm;开关高度:3.5mm;触点电流:50mA;额定电压:12V;工作寿命:10万次;; LCSC Part Name: 3*6侧按键高寿命双弹片; Supplier Part: C961745; Manufacturer: 韩国韩荣; Supplier Footprint: SMD,7x3.5mm; JLCPCB Part Class: Extended Part; Datasheet: https://item.szlcsc.com/datasheet/K2-1112SA-A4DW-01/1041850.html; Supplier: LCSC; Operating Force: 2.5N; Mounting Type: 卧贴; Length: 7mm; Width: 3.5mm; Switch Height: 3.5mm; Contact Current: 50mA; Voltage Rating: 12V; Life: 10万次; Operating Temperature: -25℃~+85℃
U126-U129 = M3外5内三
C15 = CL05B104KB54PNC: 容值:100nF;精度:±10%;额定电压:50V;材质(温度系数):X7R;; LCSC Part Name: 100nF ±10% 50V; Supplier Part: C307331; Manufacturer: SAMSUNG(三星); Supplier Footprint: 0402; JLCPCB Part Class: 基础库; Datasheet: https://atta.szlcsc.com/upload/public/pdf/source/20181009/C307331_222F7C870FD3EA5F46F538B483443886.pdf; Supplier: LCSC; Tolerance: ±10%; Voltage Rating: 50V; Temperature Coefficient: X7R; Voltage Rated: 50V
C270 = CL10A106KP8NNNC: 容值:10uF;精度:±10%;额定电压:10V;材质(温度系数):X5R;; LCSC Part Name: 10uF ±10% 10V; Supplier Part: C19702; Manufacturer: SAMSUNG(三星); Supplier Footprint: 0603; JLCPCB Part Class: Basic Part; Datasheet: https://atta.szlcsc.com/upload/public/pdf/source/20160103/1457707703378.pdf; Supplier: LCSC; Tolerance: ±10%; Voltage Rated: 10V; Temperature Coefficient: X5R
CARD2 = TF-15x15: 卡连接方式:自弹式;卡类型:MicroSD卡(TF卡);连接器类型:卡座;本体最大高度:-;触头材质:-;触头镀层:-;工作温度范围:-;焊接温度(最大值):-;; LCSC Part Name: 自弹式 MicroSD卡(TF卡) 卡座; Supplier Part: C111196; Manufacturer: SOFNG(硕方); Supplier Footprint: SMD; JLCPCB Part Class: Extended Part; Datasheet: https://atta.szlcsc.com/upload/public/pdf/source/20200911/C111196_6985EA70490FD8F56A5C3F4D017F3786.pdf; Supplier: LCSC; Card Connection Mode: 自弹式; Card Type: MicroSD卡(TF卡); Connector Type: 卡座
D1 D11-D16 = KLXES15AAA1: 极性:双向;反向截止电压(Vrwm):5V;钳位电压(Vc)@Ipp:40V;; Supplier Part: C2892490; Manufacturer: KUU; Supplier Footprint: 0402; JLCPCB Part Class: Extended Part; Datasheet: https://atta.szlcsc.com/upload/public/pdf/source/20210908/40FD94D5521B4EF0ED53BC030E77ED53.pdf; Supplier: LCSC; Polarity: 双向; Reverse Stand-Off Voltage (Vrwm): 5V; Clamping Voltage@Ipp: 40V
R2 R20-R22 R47 R62 = 0402WGF220JTCE: 电阻类型:厚膜电阻;阻值:22Ω;精度:±1%;功率:62.5mW;温度系数:±100ppm/℃;; LCSC Part Name: 厚膜电阻 22Ω ±1% 62.5mW; Supplier Part: C25092; Manufacturer: UNI-ROYAL(厚声); Supplier Footprint: 0402; JLCPCB Part Class: Basic Part; Datasheet: https://atta.szlcsc.com/upload/public/pdf/source/20200306/C422600_1E6D84923E4A46A82E41ADD87F860B5C.pdf; Supplier: LCSC; Type: 厚膜电阻; Tolerance: ±1%; Power(Watts): 62.5mW; Temperature Coefficient: ±100ppm/℃; Overload Voltage (Max): 50V; Operating Temperature Range: -55℃~+155℃
C41 C88 C914-C920 = CL03A104KO3NNNC: 容值:100nF;精度:±10%;额定电压:16V;材质(温度系数):X5R;; LCSC Part Name: 100nF ±10% 16V; Supplier Part: C307380; Manufacturer: SAMSUNG(三星); Supplier Footprint: 0201; JLCPCB Part Class: Extended Part; Datasheet: https://atta.szlcsc.com/upload/public/pdf/source/20181009/C307380_E0679AAF9658ADA26DBF30CED0CA6925.pdf; Supplier: LCSC; Tolerance: ±10%; Voltage Rated: 16V; Temperature Coefficient: X5R
C42 = CL03A105MQ3CSNH: 容值:1uF;精度:±20%;额定电压:6.3V;材质(温度系数):X5R;; LCSC Part Name: 1uF ±20% 6.3V; Supplier Part: C53067; Manufacturer: SAMSUNG(三星); Supplier Footprint: 0201; JLCPCB Part Class: Extended Part; Datasheet: https://atta.szlcsc.com/upload/public/pdf/source/20160103/1457707736151.pdf; Supplier: LCSC; Tolerance: ±20%; Voltage Rated: 6.3V; Temperature Coefficient: X5R
C48 = CL05A105KP5NNNC: 容值:1uF;精度:±10%;额定电压:10V;材质(温度系数):X5R;; LCSC Part Name: 1uF ±10% 10V; Supplier Part: C14445; Manufacturer: SAMSUNG(三星); Supplier Footprint: 0402; JLCPCB Part Class: Extended Part; Datasheet: https://atta.szlcsc.com/upload/public/pdf/source/20160103/1457707670698.pdf; Supplier: LCSC; Tolerance: ±10%; Voltage Rated: 10V; Temperature Coefficient: X5R
C909 C910 = 0402CG120J500NT: 容值:12pF;精度:±5%;额定电压:50V;材质(温度系数):C0G;; LCSC Part Name: 12pF ±5% 50V; Supplier Part: C1547; Manufacturer: FH(风华); Supplier Footprint: 0402; JLCPCB Part Class: Basic Part; Datasheet: https://atta.szlcsc.com/upload/public/pdf/source/20200305/C486355_26A10D38EF8C2A5C37091D0039909270.pdf; Supplier: LCSC; Tolerance: ±5%; Voltage Rated: 50V; Temperature Coefficient: C0G
R3 = RMC04021M5%N: 阻值:1MΩ;精度:±5%;功率:62.5mW;; LCSC Part Name: 1MΩ ±5% 62.5mW; Supplier Part: C325525; Manufacturer: Tyohm(幸亚电阻); Supplier Footprint: 0402; JLCPCB Part Class: 扩展库; Datasheet: https://atta.szlcsc.com/upload/public/pdf/source/20190115/C325525_90ADED69DA9348756F9671214E48FF04.pdf; Supplier: LCSC; Tolerance: ±5%; Power(Watts): 62.5mW
R4 = ERJ2GE0R00X: 电阻类型:-;阻值:0Ω;功率:100mW;温度系数:-100ppm/℃~+600ppm/℃;最大工作电压:-;工作温度范围:-55℃~+155℃;; LCSC Part Name: 0Ω 100mW; Supplier Part: C242160; Manufacturer: PANASONIC(松下); Supplier Footprint: 0402; JLCPCB Part Class: Extended Part; Datasheet: https://atta.szlcsc.com/upload/public/pdf/source/20181106/C242160_CA6E41971DE5A1DCD79442F3CF334CD6.pdf; Supplier: LCSC; Power(Watts): 100mW; Temperature Coefficient: -100ppm/℃~+600ppm/℃; Operating Temperature Range: -55℃~+155℃
R6 R637-R639 = 0402WGF2201TCE: 电阻类型:厚膜电阻;阻值:2.2kΩ;精度:±1%;功率:62.5mW;; LCSC Part Name: 2.2kΩ ±1% 62.5mW; Supplier Part: C25879; Manufacturer: UNI-ROYAL(厚声); Supplier Footprint: 0402; JLCPCB Part Class: Basic Part; Datasheet: https://atta.szlcsc.com/upload/public/pdf/source/20200306/C422600_1E6D84923E4A46A82E41ADD87F860B5C.pdf; Supplier: LCSC; Type: 厚膜电阻; Tolerance: ±1%; Power(Watts): 62.5mW; Temperature Coefficient: ±100ppm/℃; Overload Voltage (Max): 50V; Operating Temperature Range: -55℃~+155℃
R636 = 0201WMF0000TEE: 电阻类型:厚膜电阻;阻值:0Ω;精度:±1%;功率:50mW;; LCSC Part Name: 0Ω ±1% 50mW; Supplier Part: C473473; Manufacturer: UNI-ROYAL(厚声); Supplier Footprint: 0201; JLCPCB Part Class: Extended Part; Datasheet: https://atta.szlcsc.com/upload/public/pdf/source/20200306/C422600_1E6D84923E4A46A82E41ADD87F860B5C.pdf; Supplier: LCSC; Type: 厚膜电阻; Tolerance: ±1%; Power(Watts): 50mW; Overload Voltage (Max): 25V; Operating Temperature Range: -55℃~+155℃; Temperature Coefficient: -100ppm/℃~+600ppm/℃
X6 = XL7EL89CMI-111YLC-24M: 晶振类型:贴片晶振;频率:24MHz;常温频差:±10ppm;负载电容:10pF;频率稳定度:±20ppm;; LCSC Part Name: YSX211SL 24MHZ 4P 2016 10PF ±10PPM -40~85℃ (±20PPM); Supplier Part: C2965581; Manufacturer: YXC(扬兴晶振); Supplier Footprint: SMD2016-4P; JLCPCB Part Class: 扩展库; Datasheet: https://item.szlcsc.com/datasheet/XL7EL89CMI-111YLC-24M/3357717.html; Supplier: LCSC; Type: 贴片晶振; Normal temperature Frequency Tolerance: ±10ppm; Load Capacitance: 10pF; Frequency Stability: ±20ppm; Operating Temperature: -40℃~+85℃
U1 = RK3566
C24 C58 = CL05B104KO5NNNC: 容值:100nF;精度:±10%;额定电压:16V;材质(温度系数):X7R;; LCSC Part Name: 100nF ±10% 16V; Supplier Part: C1525; Manufacturer: SAMSUNG(三星); Supplier Footprint: 0402; JLCPCB Part Class: Basic Part; Datasheet: https://atta.szlcsc.com/upload/public/pdf/source/20160103/1457707674891.pdf; Supplier: LCSC; Tolerance: ±10%; Voltage Rated: 16V; Temperature Coefficient: X7R
C25 = CL05B104KO5NNNC: 容值:100nF;精度:±10%;额定电压:16V;材质(温度系数):X7R;; LCSC Part Name: 100nF ±10% 16V; Supplier Part: C1525; Manufacturer: SAMSUNG(三星); Manufacturer Part: CL05A105KA5NQNC; Supplier Footprint: 0402; JLCPCB Part Class: 基础库; Datasheet: https://atta.szlcsc.com/upload/public/pdf/source/20160218/1457707763339.pdf; Supplier: LCSC; Tolerance: ±10%; Voltage Rated: 16V; Temperature Coefficient: X7R; Check: true
U12 = BMP280: Bosch气压传感器新品，可测量大气压力，带高精度温度测量，可校准精确计算海拔高度。I2C或SPI接口，宽量程（300-1100hpa），精度高; Supplier Part: C83291; Manufacturer: Bosch(博世); Supplier Footprint: LGA-8(2x2.5); JLCPCB Part Class: 扩展库; Datasheet: https://atta.szlcsc.com/upload/public/pdf/source/20200702/C83291_F39E84AB7DFC569A4C7554F8659640A1.pdf; Supplier: LCSC
U14 = BMI270: IMU-惯性测量单元; Supplier Part: C2836813; Manufacturer: Bosch(博世); Supplier Footprint: LGA-14(2.5x3); JLCPCB Part Class: 扩展库; Datasheet: https://atta.szlcsc.com/upload/public/pdf/source/20210625/C2836813_35E1F3F92097F45A3828DF13DDBA01A5.pdf; Supplier: LCSC; Accelerometer Sensing Axis: X,Y,Z; Acceleration Measurement Range (MAX): ±16g; Gyroscope Sensing Axis: X,Y,Z; Gyroscope Measurement Range (MAX): ±2000dps; Sensor Type: 加速度计陀螺仪; Output Bits: 16bit; Interface: I2C；SPI; Voltage - Supply: 1.71V~3.6V; Cache Size: 2KB; Standby Current: 3.5uA; Operating Temperature: -40℃~+85℃
U17 = BMM150: 磁传感器 3轴磁罗盘; LCSC Part Name: 三轴地磁式传感器; Supplier Part: C171681; Manufacturer: Bosch(博世); Supplier Footprint: WLCSP-12; JLCPCB Part Class: 扩展库; Datasheet: https://atta.szlcsc.com/upload/public/pdf/source/20180327/C171681_AC95244FE88EF9D8F701E0ABF38F9AC1.pdf; Supplier: LCSC

## Nets
GND: C9.2 C15.1 C24.1 C25.1 C27.1 C28.1 C31.1 C35.1 C36.1 C37.2 C38.2 C41.1 C42.2 C48.1 C58.1 C88.1 C270.1 C272.1 C273.1 C278.1 C909.2 C910.2 C911.1 C912.2 C913.2 C914.1 C915.1 C916.1 C917.1 C918.1 C919.1 C920.1 CARD2.6(VSS) CARD2.10(G3) CARD2.11(G4) CARD2.12(G1) CARD2.13(G2) D1.1(K) D11.1(K) D12.1(K) D13.1(K) D14.1(K) D15.1(K) D16.1(K) H3.3 LED3.1(C) MIC2.2(-) Q9.2(S) R10.1 R63.2 R626.2 R628.2 R636.1 SW2.3 SW2.4 SW3.3 SW3.4 SW4.1 SW4.3 SW4.4 SW12.3 SW12.4 U1.1J5(SYSPLL_AVSS) U1.1N17(PMUPLL_AVSS) U12.1(GND) U12.7(GND) U14.1(SDO) U14.6(GNDIO) U14.7(GND) U16.3 U16.4 U17.A5(CSB) U17.C1(SDO) U17.C5(GND) U17.E1(GND) U17.E3(GND) U18.3 U18.4 U141.5(GND) U141.6(OE#) X6.2(GND) X6.4(GND) ; also on sheet 1 2 3 4 5 6 7 8 9 10 11 12 13 21 22 23 24 25
VCC3V3_PMU: C918.2 C919.2 R6.1 R637.1 R638.1 R639.1 U1.1N15(PMUIO2) U1.1P16(PMUIO1) ; also on sheet 21 22
VCC3V3_SD: C15.2 C270.2 CARD2.4(VDD) ; also on sheet 22
VCC3V3_SYS: C9.1 U141.10(VCC) ; also on sheet 9 10 21 22 23
VCC5V0_SYS: D10.1(K) R627.2 U16.1 ; also on sheet 6 7 10 21 22
VCC_3V3: C24.2 C25.2 C58.2 C88.2 R23.2 U1.1N5(VCCIO5_1) U1.1N6(VCCIO5_2) U12.2(CSB) U12.5(SDO) U12.6(VDDIO) U12.8(VDD) U14.5(VDDIO) U14.8(VDD) U14.12(CSB) U17.A1(PS) U17.B2(VDDIO) U17.E5(VDD) ; also on sheet 7 8 13 21 22 25
VCC_UART: Q3.1(G) R18.2 R23.1
VCCA1V8_PMU: C41.2 C912.1 U1.1N18(PMUPLL_AVDD_1V9) ; also on sheet 22 24
VCCA_1V8: C913.1 C916.2 R120.1 U1.1H4(SYSPLL_AVDD_1V8) ; also on sheet 8 13 22
VCCIO_ACODEC: R115.1 ; also on sheet 5 22
VDDA0V9_PMU: C48.2 C911.2 C914.2 C920.2 U1.1N16(PMU_VDD_LOGIC_0V9) U1.1P17(PMUPLL_AVDD_0V9) ; also on sheet 22
VDDA_0V9: C42.1 C915.2 U1.1H5(SYSPLL_AVDD_0V9) ; also on sheet 8 22
AUDIO_CTRL: R628.1 U138.1(CTRL) ; also on sheet 11
BM150_SCL: U14.3(ASCX) U17.A3(SCK)
BM150_SDA: U14.2(ASDX) U17.B4(SDI)
DBG_RXD: H3.1 R287.2
DBG_TXD: H3.2 Q3.2(S) Q3.3(D) R18.1 U1.1V19(GPIO0_D0_u)
DVP_PWREN_H: U1.1T20(GPIO0_B0_u) ; also on sheet 10
EC20_AP_N: C27.2 R30.2 U141.2(1D-)
EC20_AP_P: C28.2 R29.2 U141.1(1D+)
EC20_MIC_N: C39.1 C40.1 MIC1.2(-) R10.2 ; also on sheet 12
EC20_MIC_P: C37.1 C38.1 C39.2 C40.2 MIC1.1(+) ; also on sheet 12
EC20_SPK_N: C30.1 C36.2 ; also on sheet 12
EC20_SPK_P: C29.1 C35.2 ; also on sheet 12
EMMC_D0: SW12.1 ; also on sheet 3 25
FLASH_VOL_SEL: U1.AF38(GPIO0_A7_u) ; also on sheet 21
GPIO0_A5: U1.AG37(GPIO0_A5_d) ; also on sheet 9
GPIO0_C5: U1.1U19(GPIO0_C5_d) ; also on sheet 7
GPIO0_C6: R632.1 U1.1T18(GPIO0_C6_d)
GPIO3_D7: R63.1 U141.9(S) ; also on sheet 11
I2C0_SCL_PMIC: R6.2 U1.AJ37(GPIO0_B1_u) ; also on sheet 21 22
I2C0_SDA_PMIC: R637.2 U1.AK38(GPIO0_B2_u) ; also on sheet 21 22
I2C1_SCL_TP: R638.2 U1.AK37(GPIO0_B3_u) U12.3(SDI) U14.14(SDX) ; also on sheet 7 9
I2C1_SDA_TP: R639.2 U1.AM38(GPIO0_B4_u) U12.4(SCK) U14.13(SCX) ; also on sheet 7 9
IO3_C3_d: R17.2 U1.AR2(GPIO3_C3_d)
MICP: C273.2 MIC2.1(+) R116.1 ; also on sheet 22
MIPI_DSI_RESET: U1.AP4(GPIO3_C1_d) ; also on sheet 7
PMIC_INT_L: U1.1R19(GPIO0_A3_u) ; also on sheet 22
PMIC_SLEEP_H: U1.1P19(GPIO0_A2_d) ; also on sheet 21 22
PWRON_KEY: R121.2 ; also on sheet 22
RESETN: C917.2 R4.2 R117.2 U1.AG38(nPOR_u) ; also on sheet 22
SARADC_VIN0: R119.2 ; also on sheet 13
SDMMC0_CLK: CARD2.5(CLK) D13.2(A) ; also on sheet 3
SDMMC0_CMD: R22.1 ; also on sheet 3
SDMMC0_D0: R47.1 ; also on sheet 3
SDMMC0_D1: R62.1 ; also on sheet 3
SDMMC0_D2: R20.1 ; also on sheet 3
SDMMC0_D3: R21.1 ; also on sheet 3
SDMMC0_DET_L: R114.1 U1.AF37(GPIO0_A4_u)
SPK_OUT_N: U18.1 U141.7(D-)
SPK_OUT_P: U18.2 U141.8(D+)
SPK_OUTN: U141.4(2D-) ; also on sheet 22
SPK_OUTP: U141.3(2D+) ; also on sheet 22
TSADC_SEUT_M0: R4.1 U1.1R20(GPIO0_A1_z)
UART2_TX_M0_DEBUG: R287.1 U1.1U18(GPIO0_D1_u)
XIN24M: C910.1 R3.1 U1.AD37(XIN24M) X6.3
XOUT24M: R2.2 R3.2 U1.AD38(XOUT24M)
$3N1242: C909.1 R2.1 X6.1
$3N1252: R636.2 U1.1M18(TVSS)
$19N5065: C272.2 R115.2 R116.2
$19N5100: C32.2 C33.2 C34.2 R627.1 U138.6(VCC)
$19N5102: C32.1 C33.1 C34.1 R626.1 U138.7(GND)
$19N5106: C31.2 U138.2(Bypass)
$19N5107: R629.2 U138.3(INP)
$19N5108: R630.2 U138.4(INN)
$19N5109: C30.2 R630.1
$19N5110: C29.2 R629.1
$19N5113: R30.1 U138.5(VON)
$19N5114: R29.1 U138.8(VoP)
$21N515: D10.2(A) Q9.3(D) U16.2
$21N530: Q9.1(G) R632.2
$21N2627: R119.1 R120.2 SW2.1 SW2.2
$21N2632: C278.2 R121.1 SW3.1 SW3.2
$21N15981: R117.1 SW4.2
$21N15986: LED3.2(A) R17.1
Net-(CARD2-1): CARD2.1(DAT2) D1.2(A) R20.2
Net-(CARD2-2): CARD2.2(CD/DAT3) D11.2(A) R21.2
Net-(CARD2-3): CARD2.3(CMD) D12.2(A) R22.2
Net-(CARD2-7): CARD2.7(DAT0) D14.2(A) R47.2
Net-(CARD2-8): CARD2.8(DAT1) D15.2(A) R62.2
Net-(CARD2-9): CARD2.9(CD) D16.2(A) R114.2

Not connected (* = marked no-connect by the designer): SW12 2*; U1 1M19(GPIO0_D4_d)* 1N19(GPIO0_D3_d)* 1N20(GPIO0_D5_d)* 1P3(GPIO3_C4_d)* 1P4(GPIO3_C5_d)* 1P18(GPIO0_A0_d)* 1P20(GPIO0_D6_d)* 1R16(GPIO0_B6_u)* 1R17(GPIO0_B7_d)* 1R18(GPIO0_C1_d)* 1T4(GPIO3_B5_d)* 1T19(GPIO0_C0_d)* 1U3(GPIO3_B4_d)* 1U4(GPIO3_A6_d)* 1U5(GPIO3_A1_d)* 1U20(GPIO0_B5_u)* 1V2(GPIO3_B6_d)* 1V3(GPIO3_A7_d)* 1V20(GPIO0_C7_d)* AJ38(GPIO0_A6_d)* AM37(GPIO0_C2_d)* AN37(GPIO0_C4_d)* AN38(GPIO0_C3_d)* AP3(GPIO3_C2_d)* AP5(GPIO3_B7_d)* AP6(GPIO3_B3_d)* AP7(GPIO3_B1_d)* AP9(GPIO3_A5_d)* AP10(GPIO3_A3_d)* AR4(GPIO3_C0_d)* AR6(GPIO3_B2_d)* AR7(GPIO3_B0_d)* AR9(GPIO3_A4_d)* AR10(GPIO3_A2_d)*; U14 4(INT1)* 9(INT2)* 10(OCSB) 11(OSDO); U17 D2(INT)* D4(DRY)*

## Notes on the sheets
sheet 15
- 软件dts的电压配置严格与硬件设计保持一致！
- Check the software configuration(dts)
  of voltage level, which must be
  keep the same as hardware design.
- VCCIO5
sheet 16
- 信号防干扰电路
sheet 17
- 9 Axis
sheet 18
- MicroSD Card
sheet 19
- FAN
- KEY
sheet 20
- AFA FOR EC20
- MIC FOR TSPI/EC20
- SPK转换
- AUDIO
